# EasyEDA Pro project ProPrj_rk3568B2_2026-10-28.epro, schematic Schematic1, sheets 1 to 12 of 19

## Sheets
1 外设资源分配&上电时序: Board Name: Schematic1; Create Date: 2025-08-15; Page Name: 外设资源分配&上电时序; Project Name: ProDoc_Schematic1_2026-03-04; Schematic Name: Schematic1; Update Date: 2025-09-28; BladeWidth: 10; Company: 嘉立创EDA; Page Size: A4; RegionStart: 1; ShowBorder: 1; TitleBlock: 1; TitleBlockPosition: 3; Version: V1.0; XRegionCount: 6; YRegionCount: 4
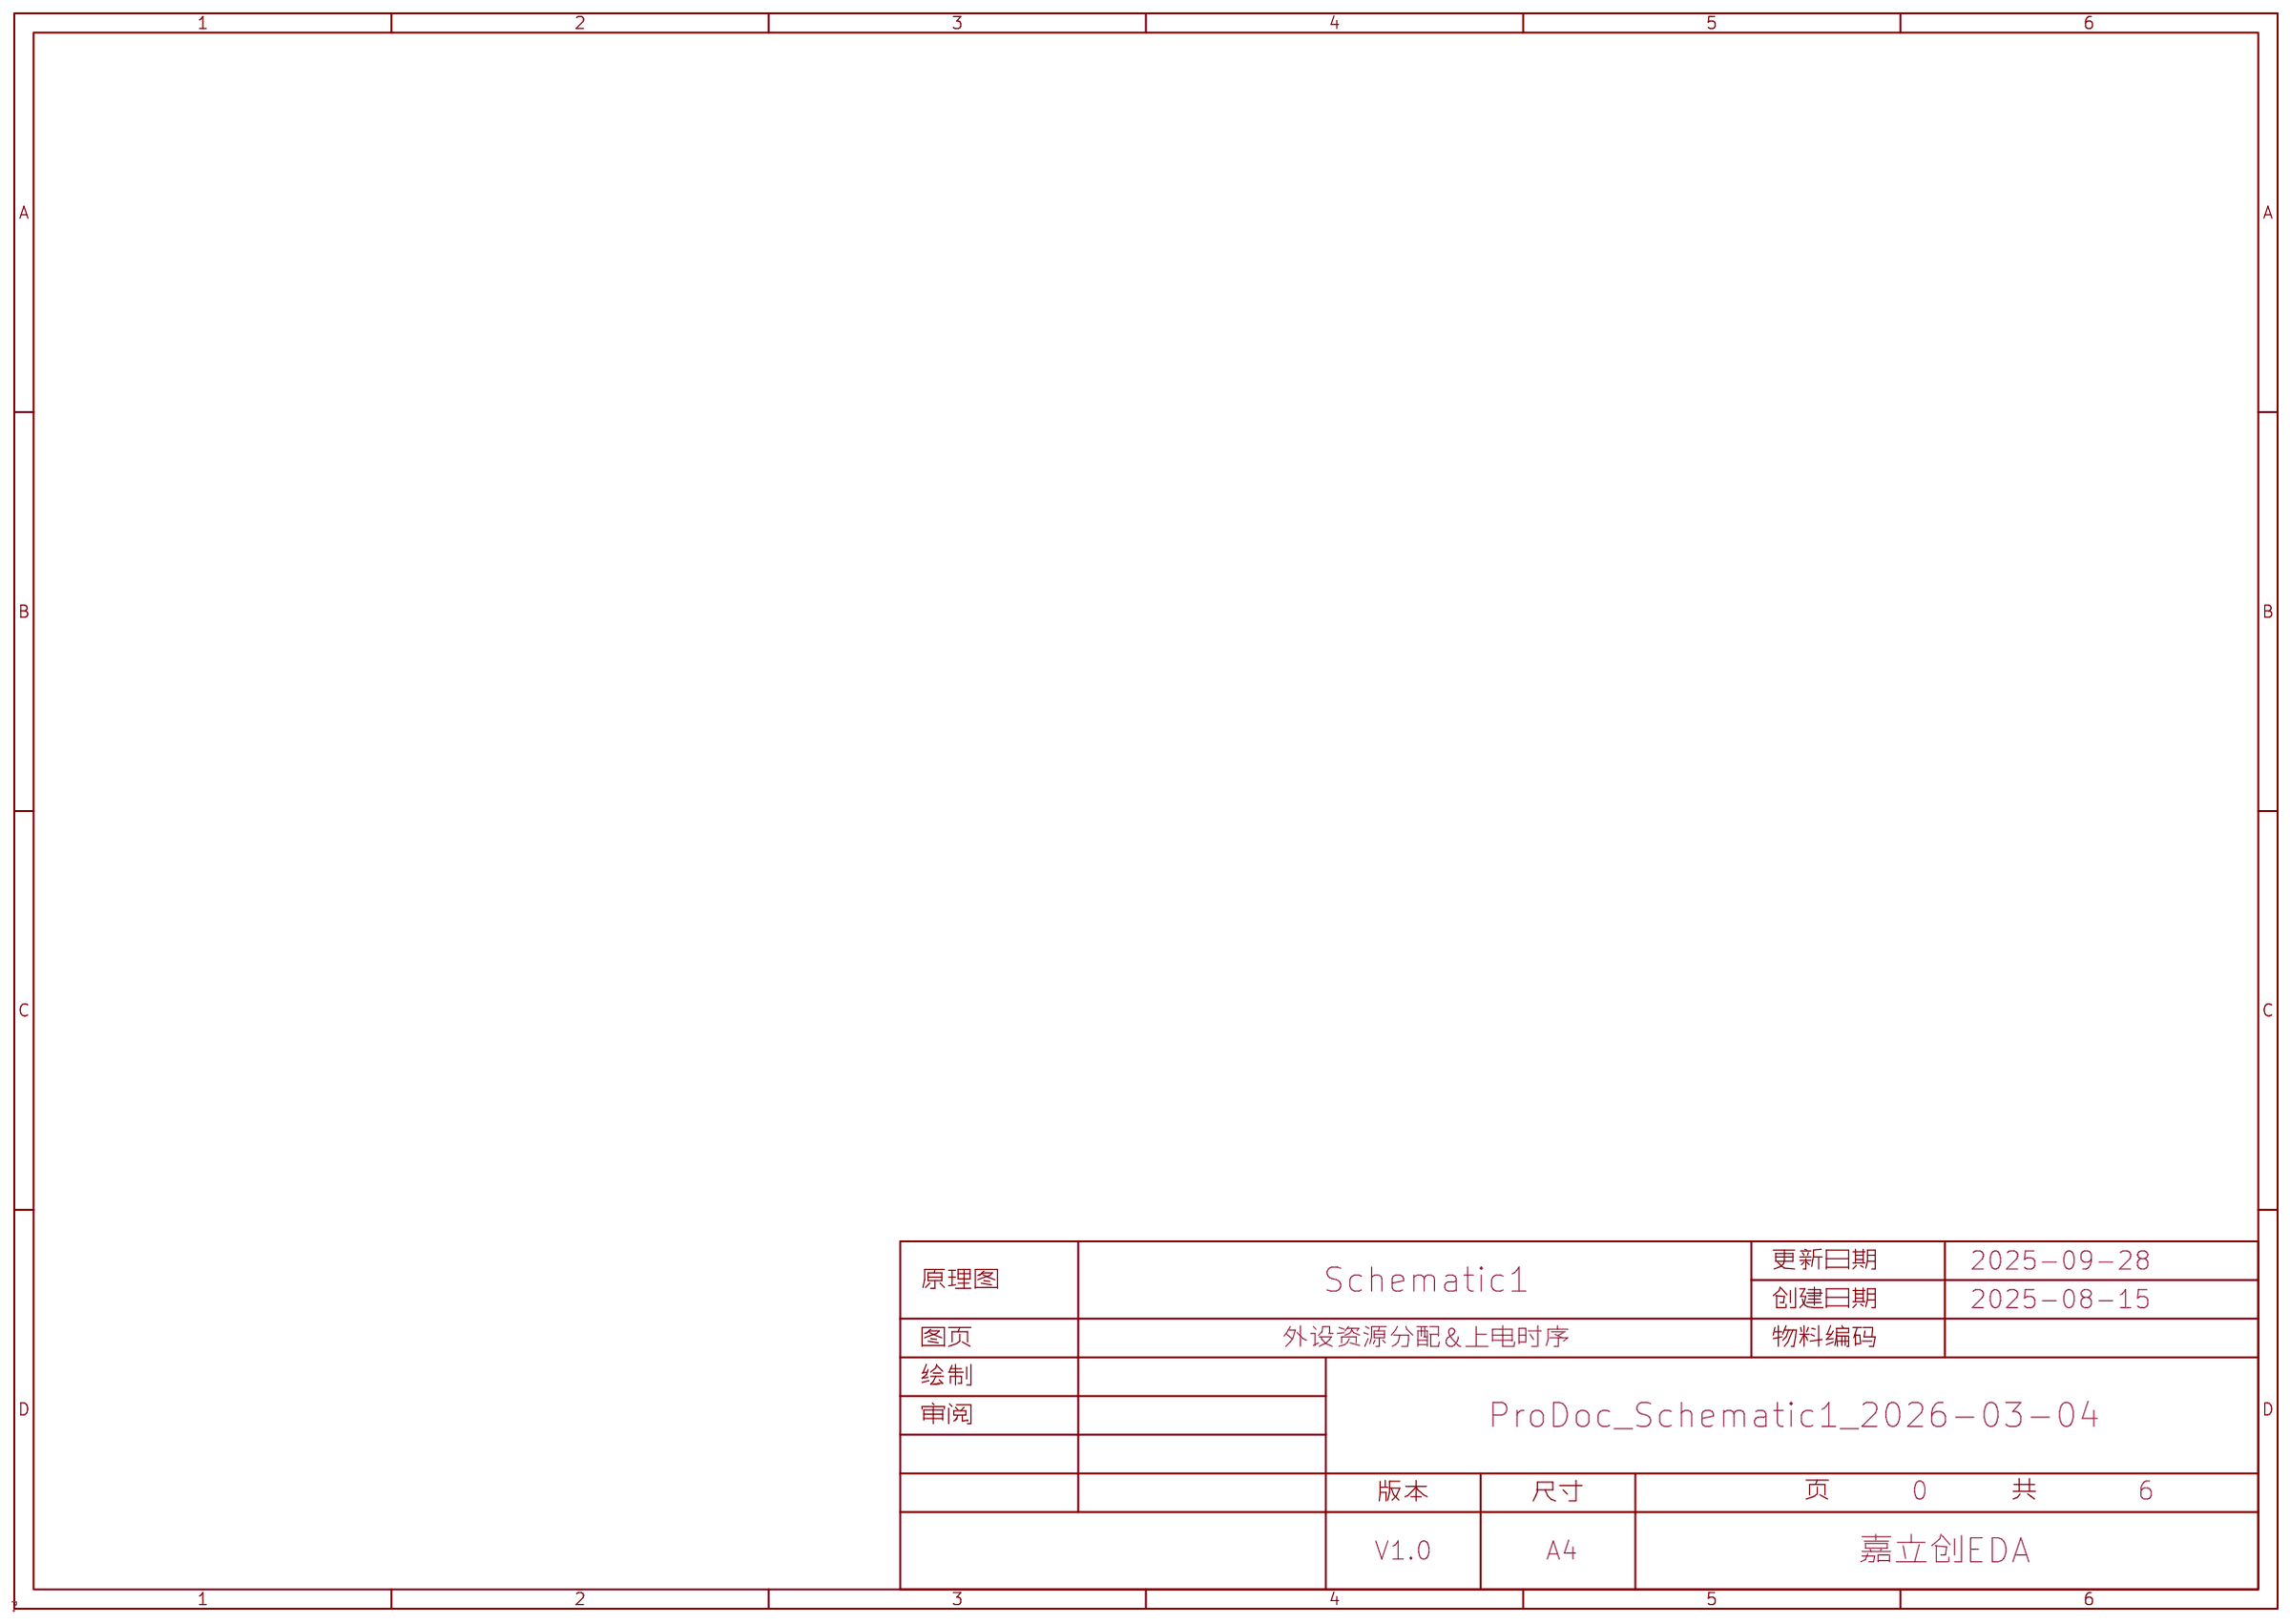
[diagram p0: 外设资源分配&上电时序]
2 EMMC: Board Name: Board1; Create Date: 2025-09-11; Page Name: EMMC; Project Name: RK3568B2地瓜派; Update Date: 2025-09-11
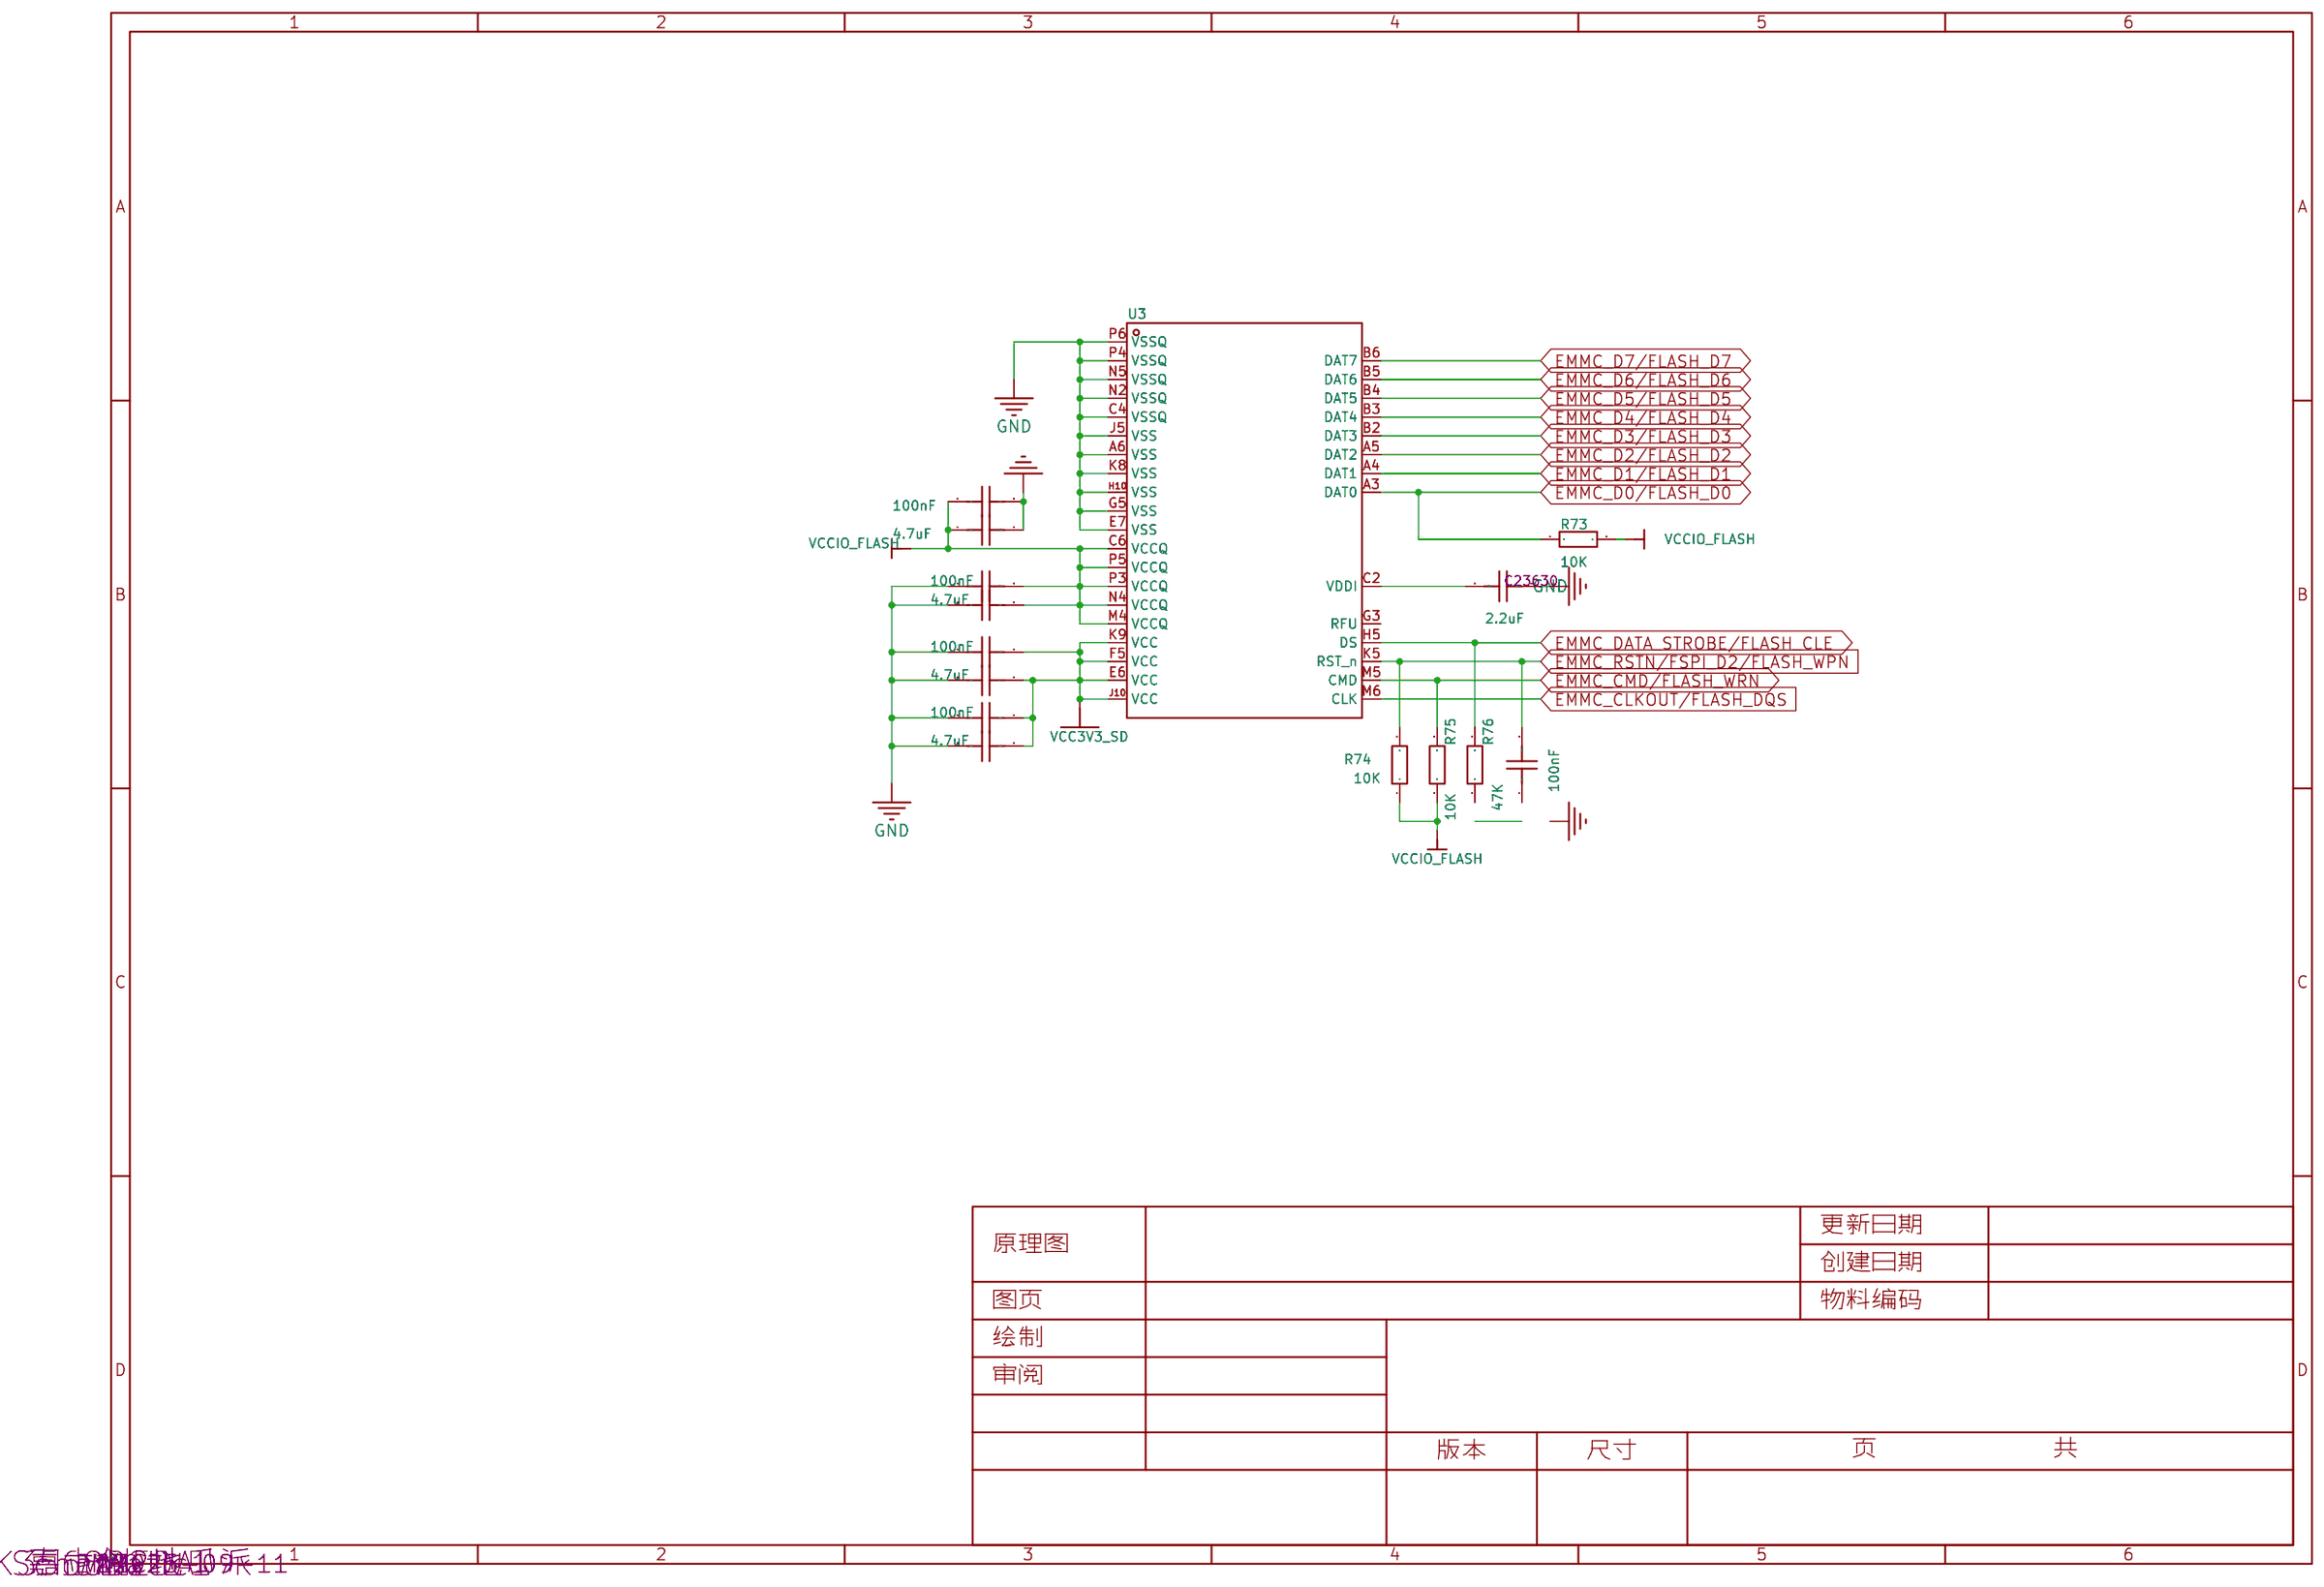
[diagram p1: EMMC]
3 SOC_DISPLAY: Board Name: Board1; Page Name: SOC_DISPLAY; Project Name: RK3568_LPD4X_120P_Core; Update Date: 2025-08-25
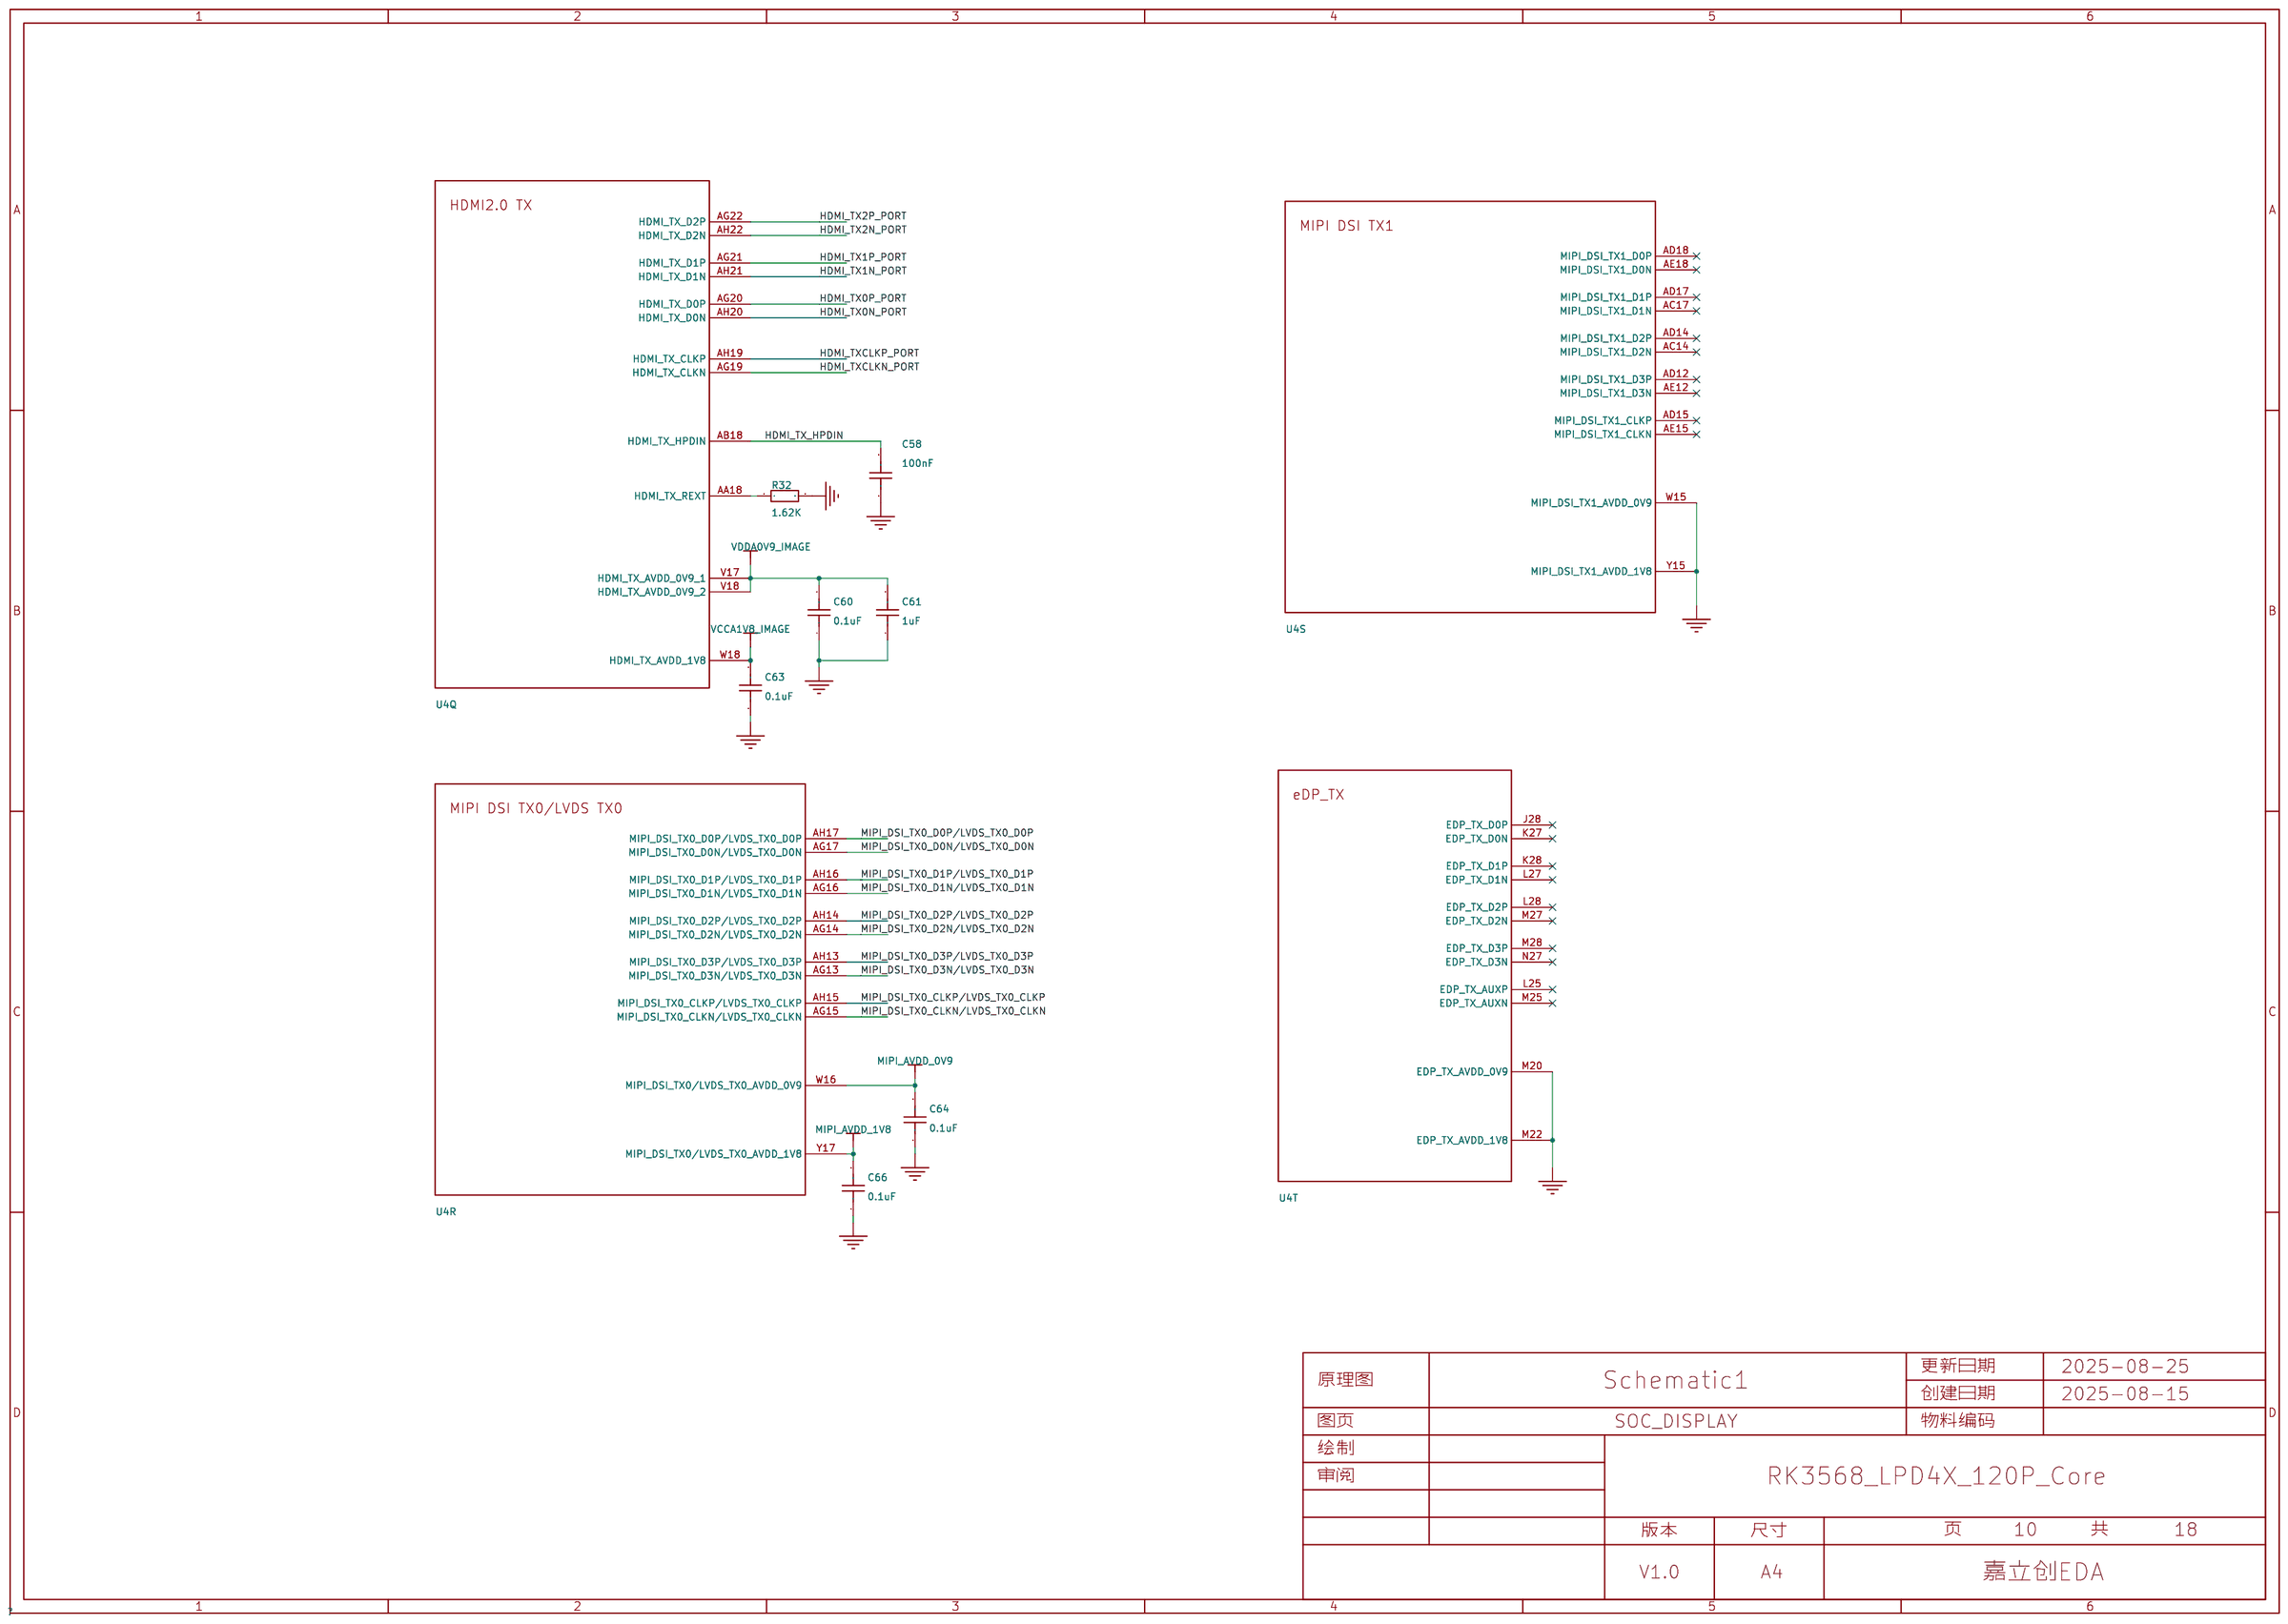
[diagram p2: SOC_DISPLAY]
4 SOC_CAM: Board Name: Board1; Page Name: SOC_CAM; Project Name: RK3568_LPD4X_120P_Core; Update Date: 2025-08-22
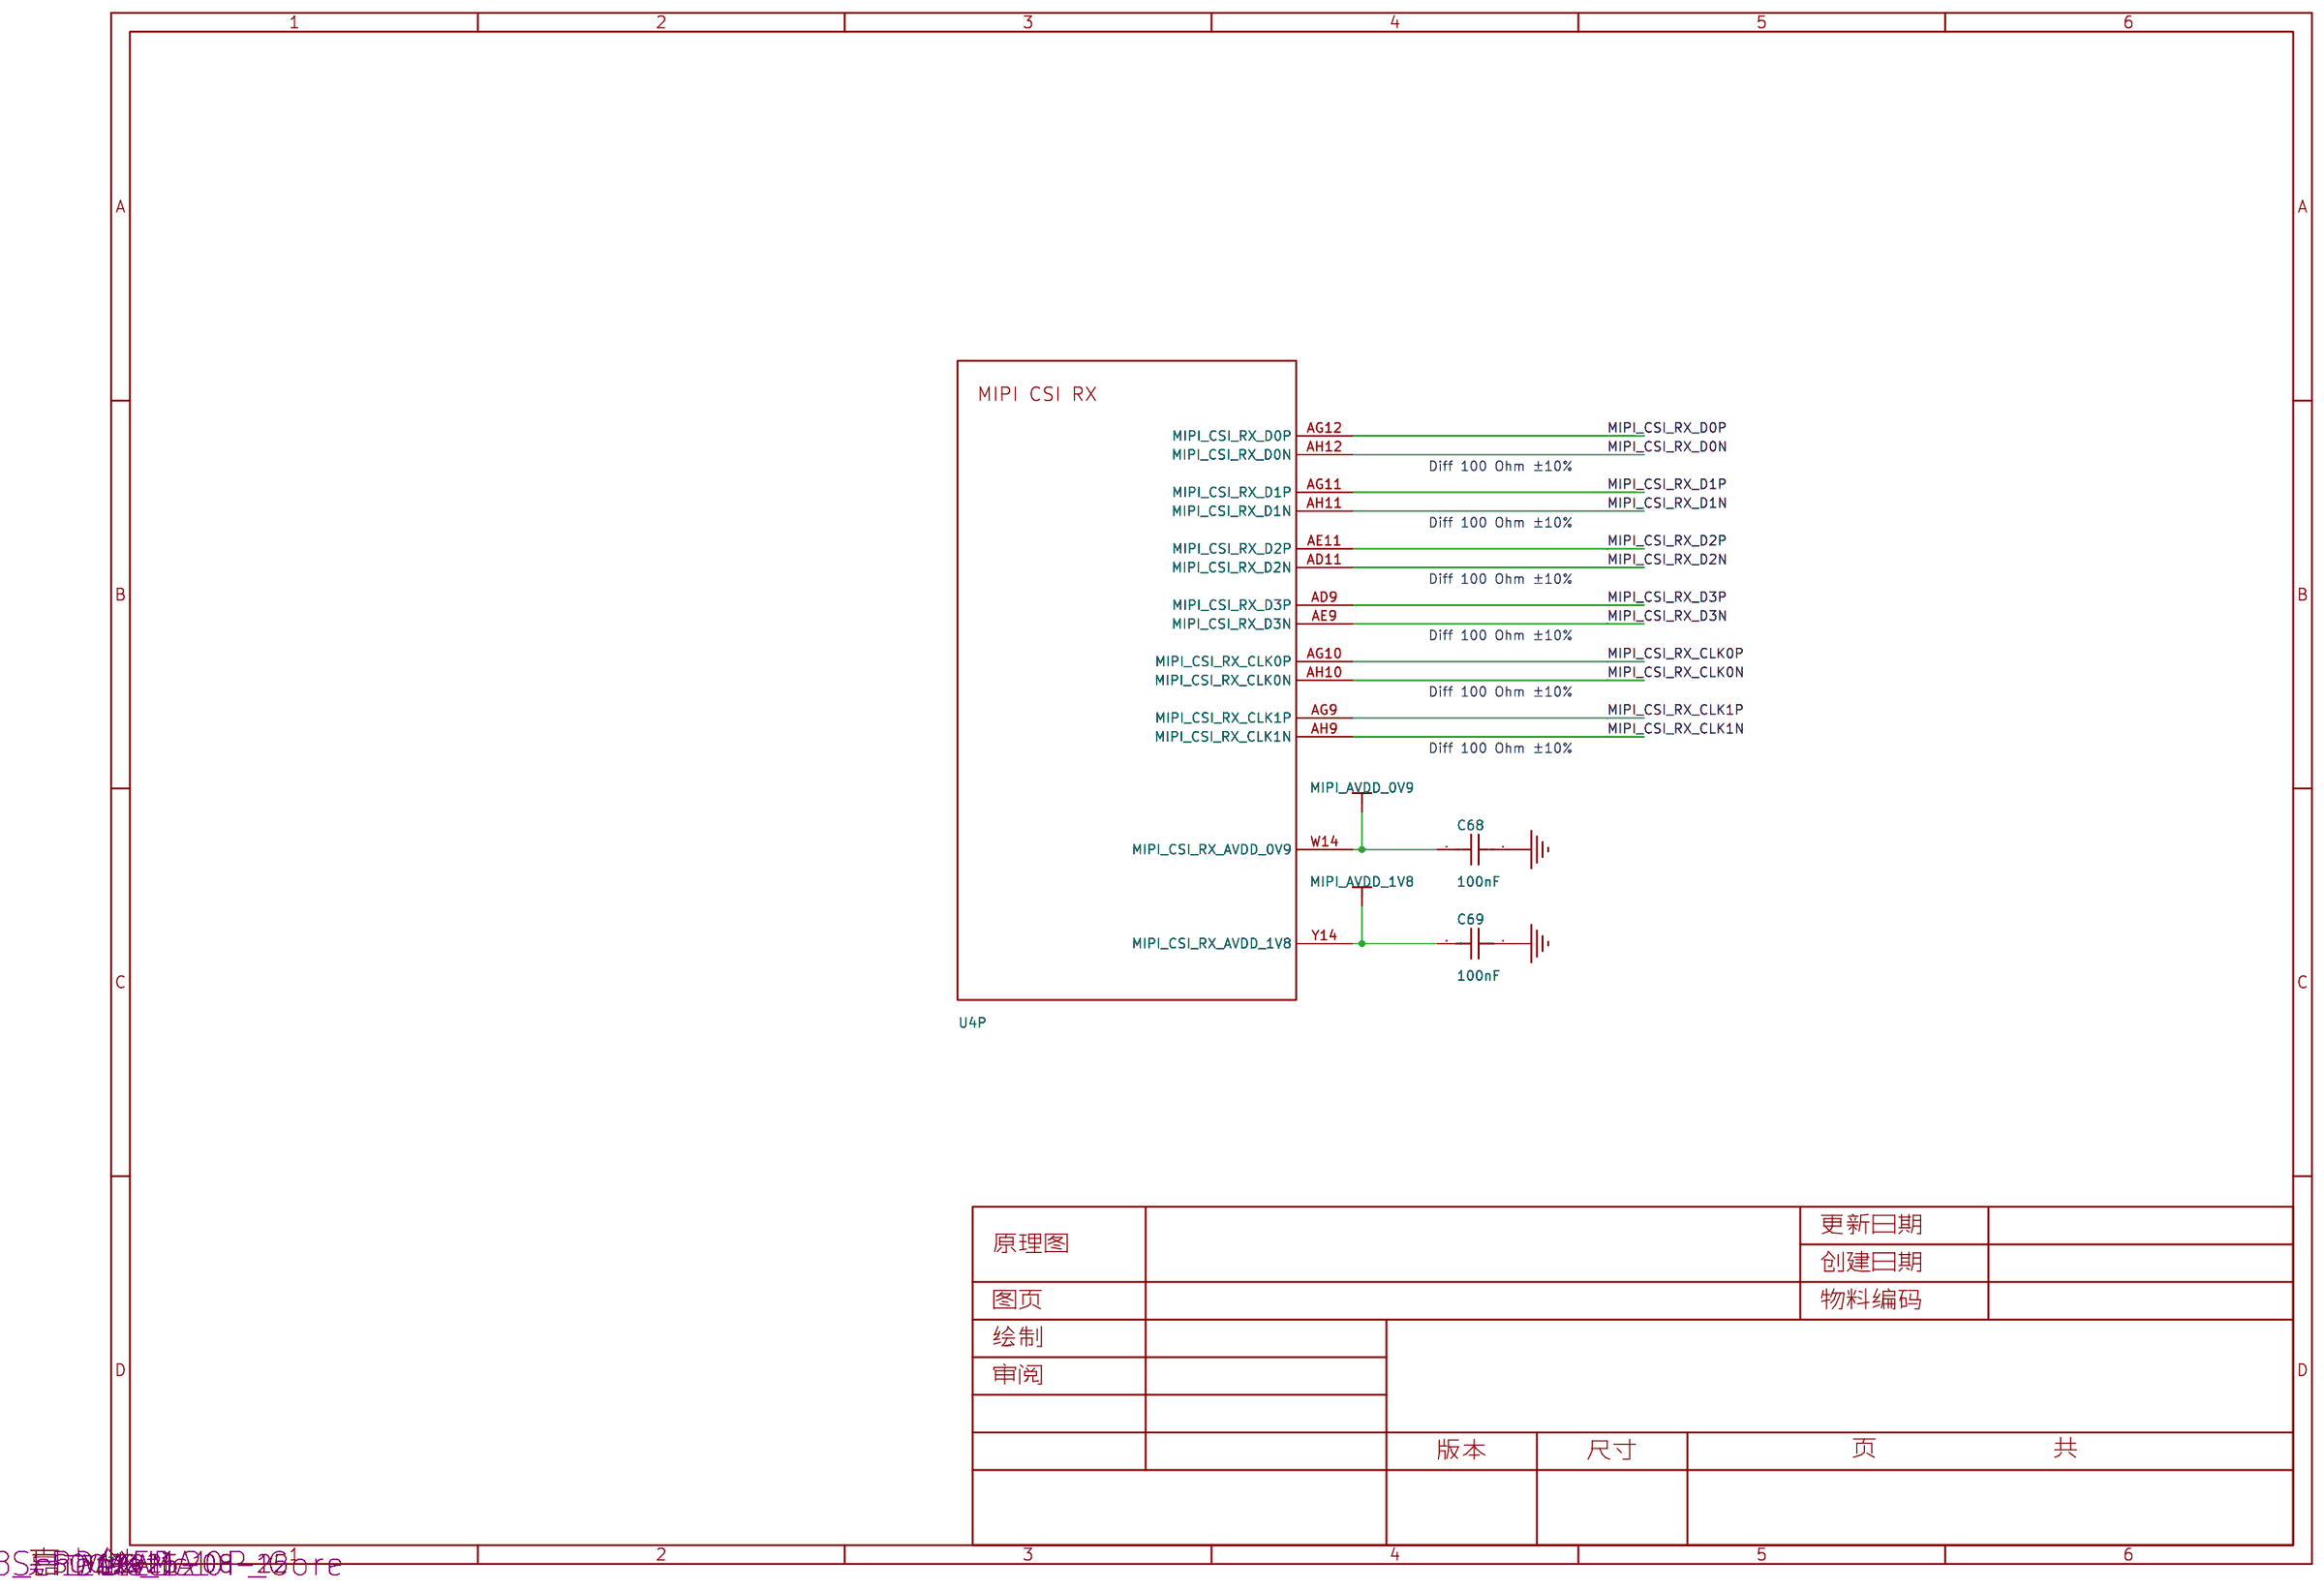
[diagram p3: SOC_CAM]
5 SOC_SOUND: Board Name: Board1; Create Date: 2025-09-11; Page Name: SOC_SOUND; Project Name: RK3568B2地瓜派; Update Date: 2025-09-11
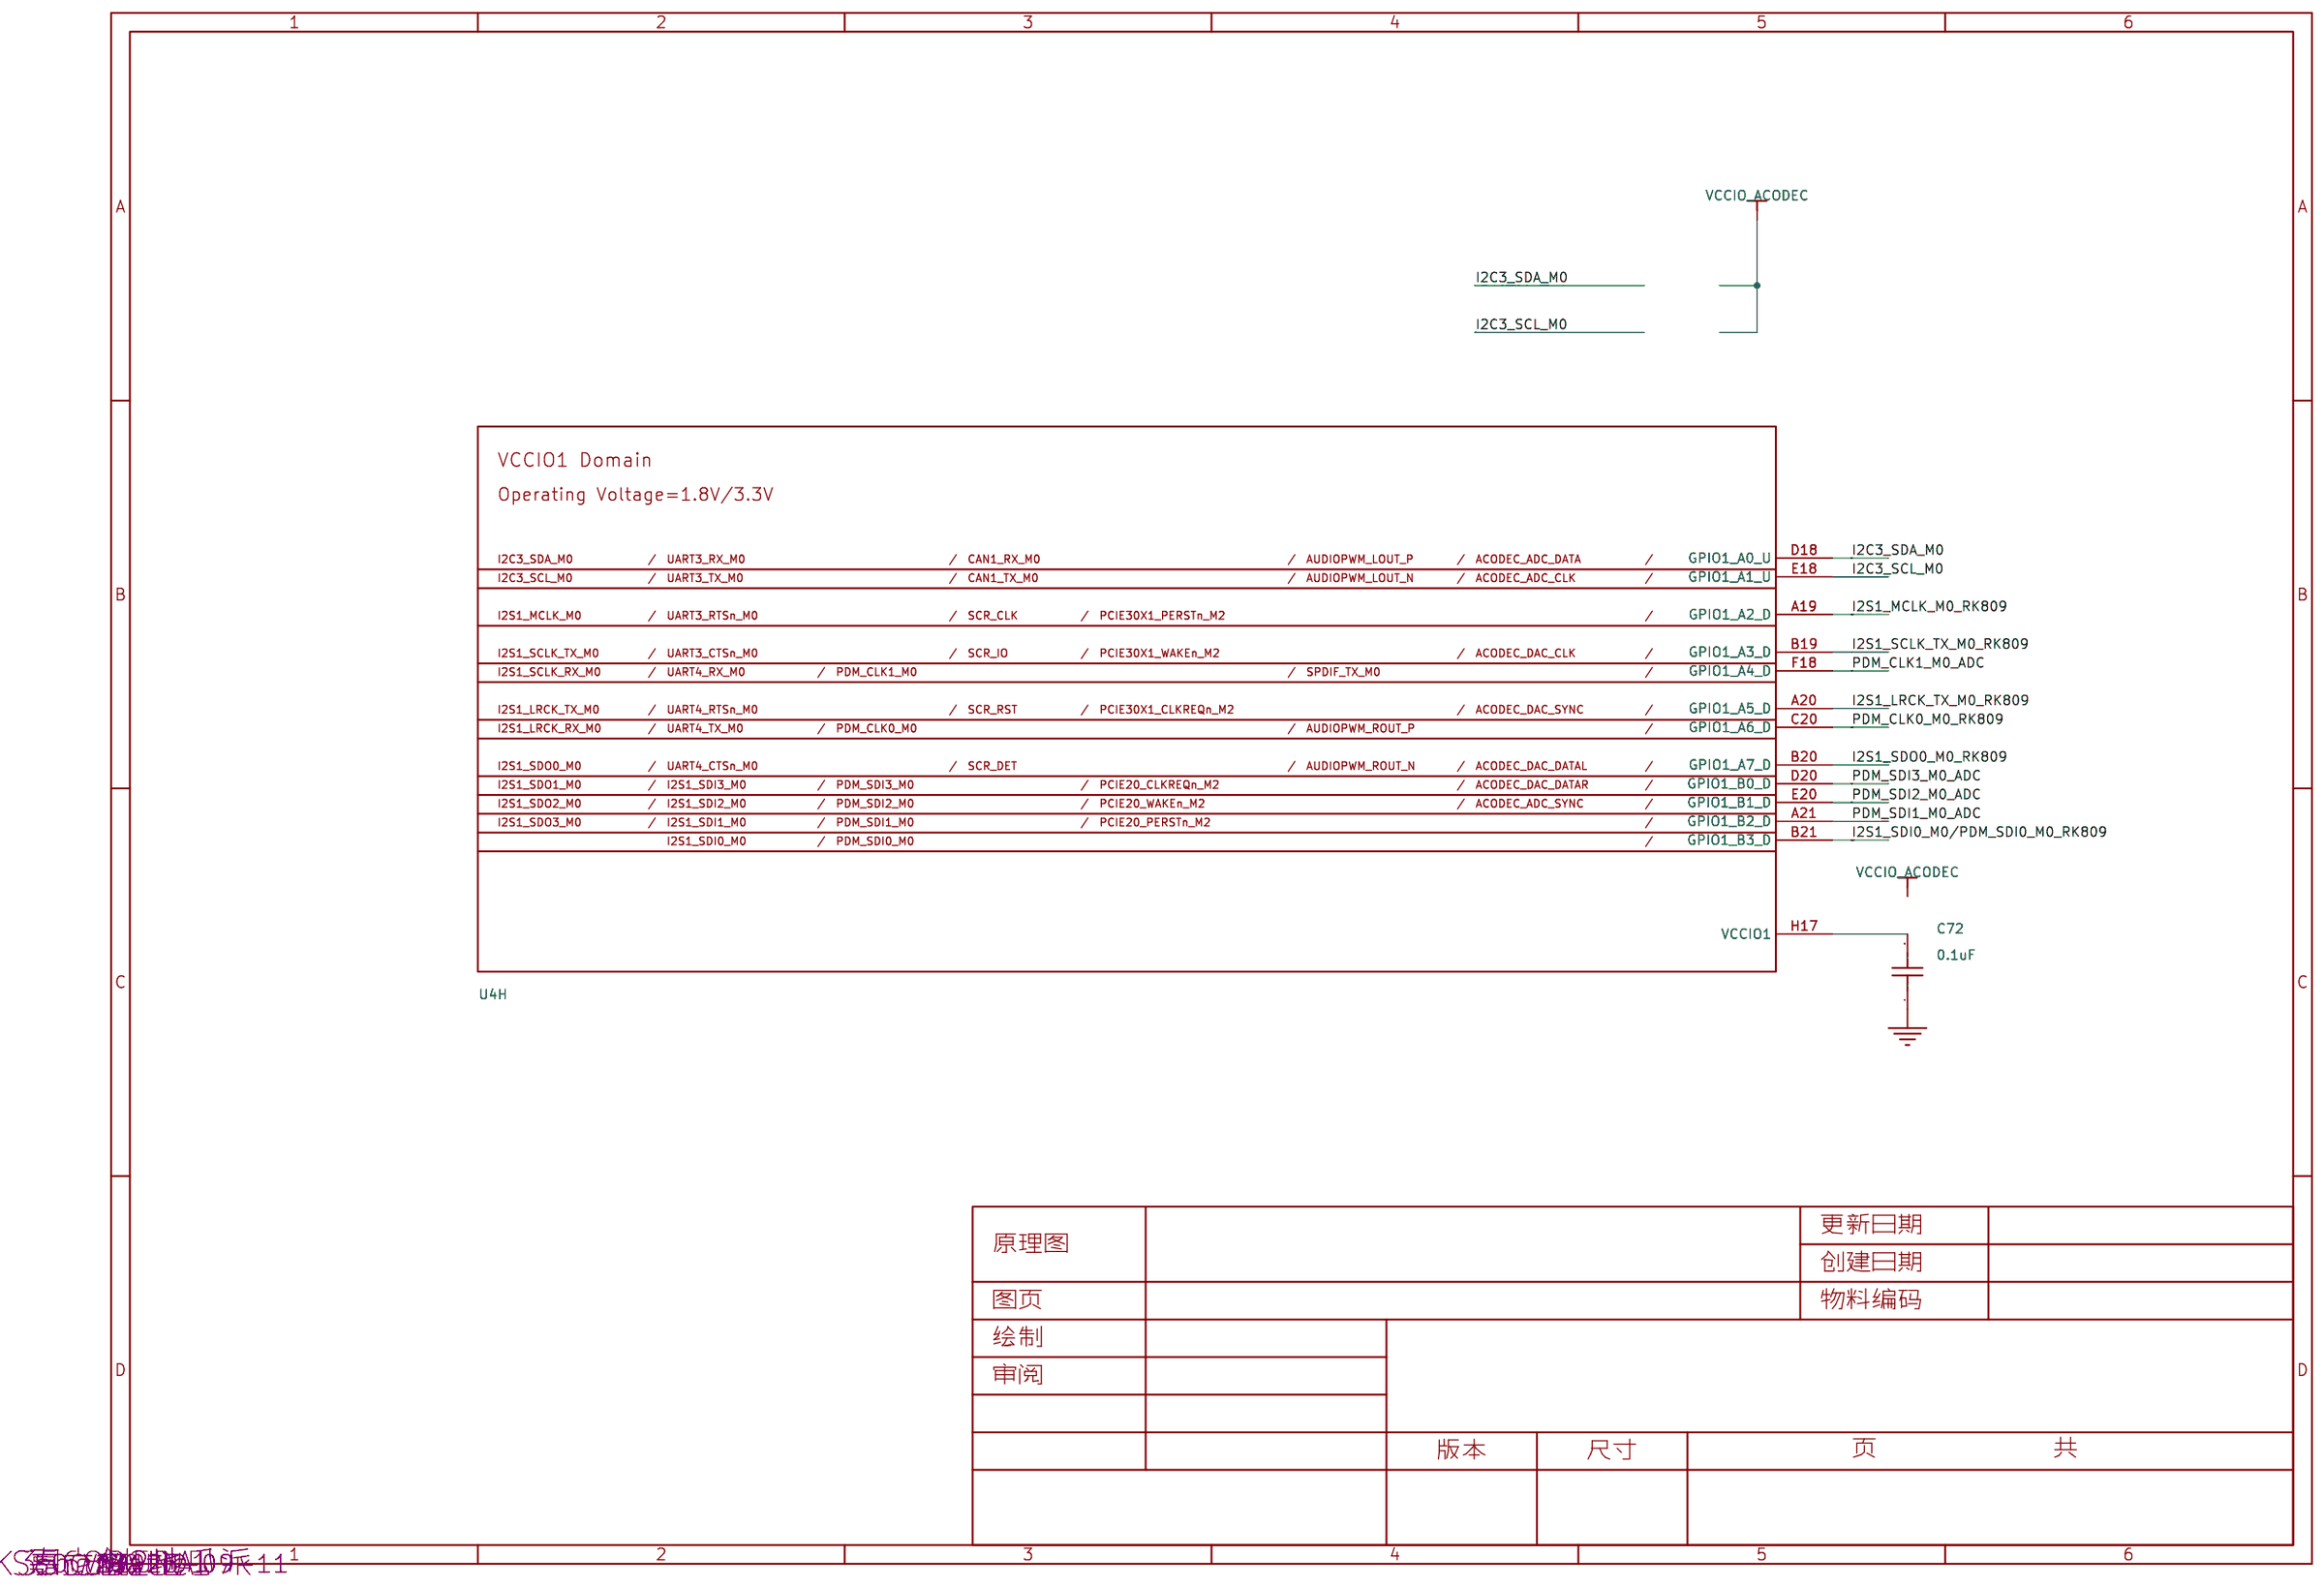
[diagram p4: SOC_SOUND]
6 SOC_MAC/SAR/I2S: Create Date: 2026-03-04; Page Name: SOC_MAC/SAR/I2S; Project Name: rk3568B2; Update Date: 2026-03-05
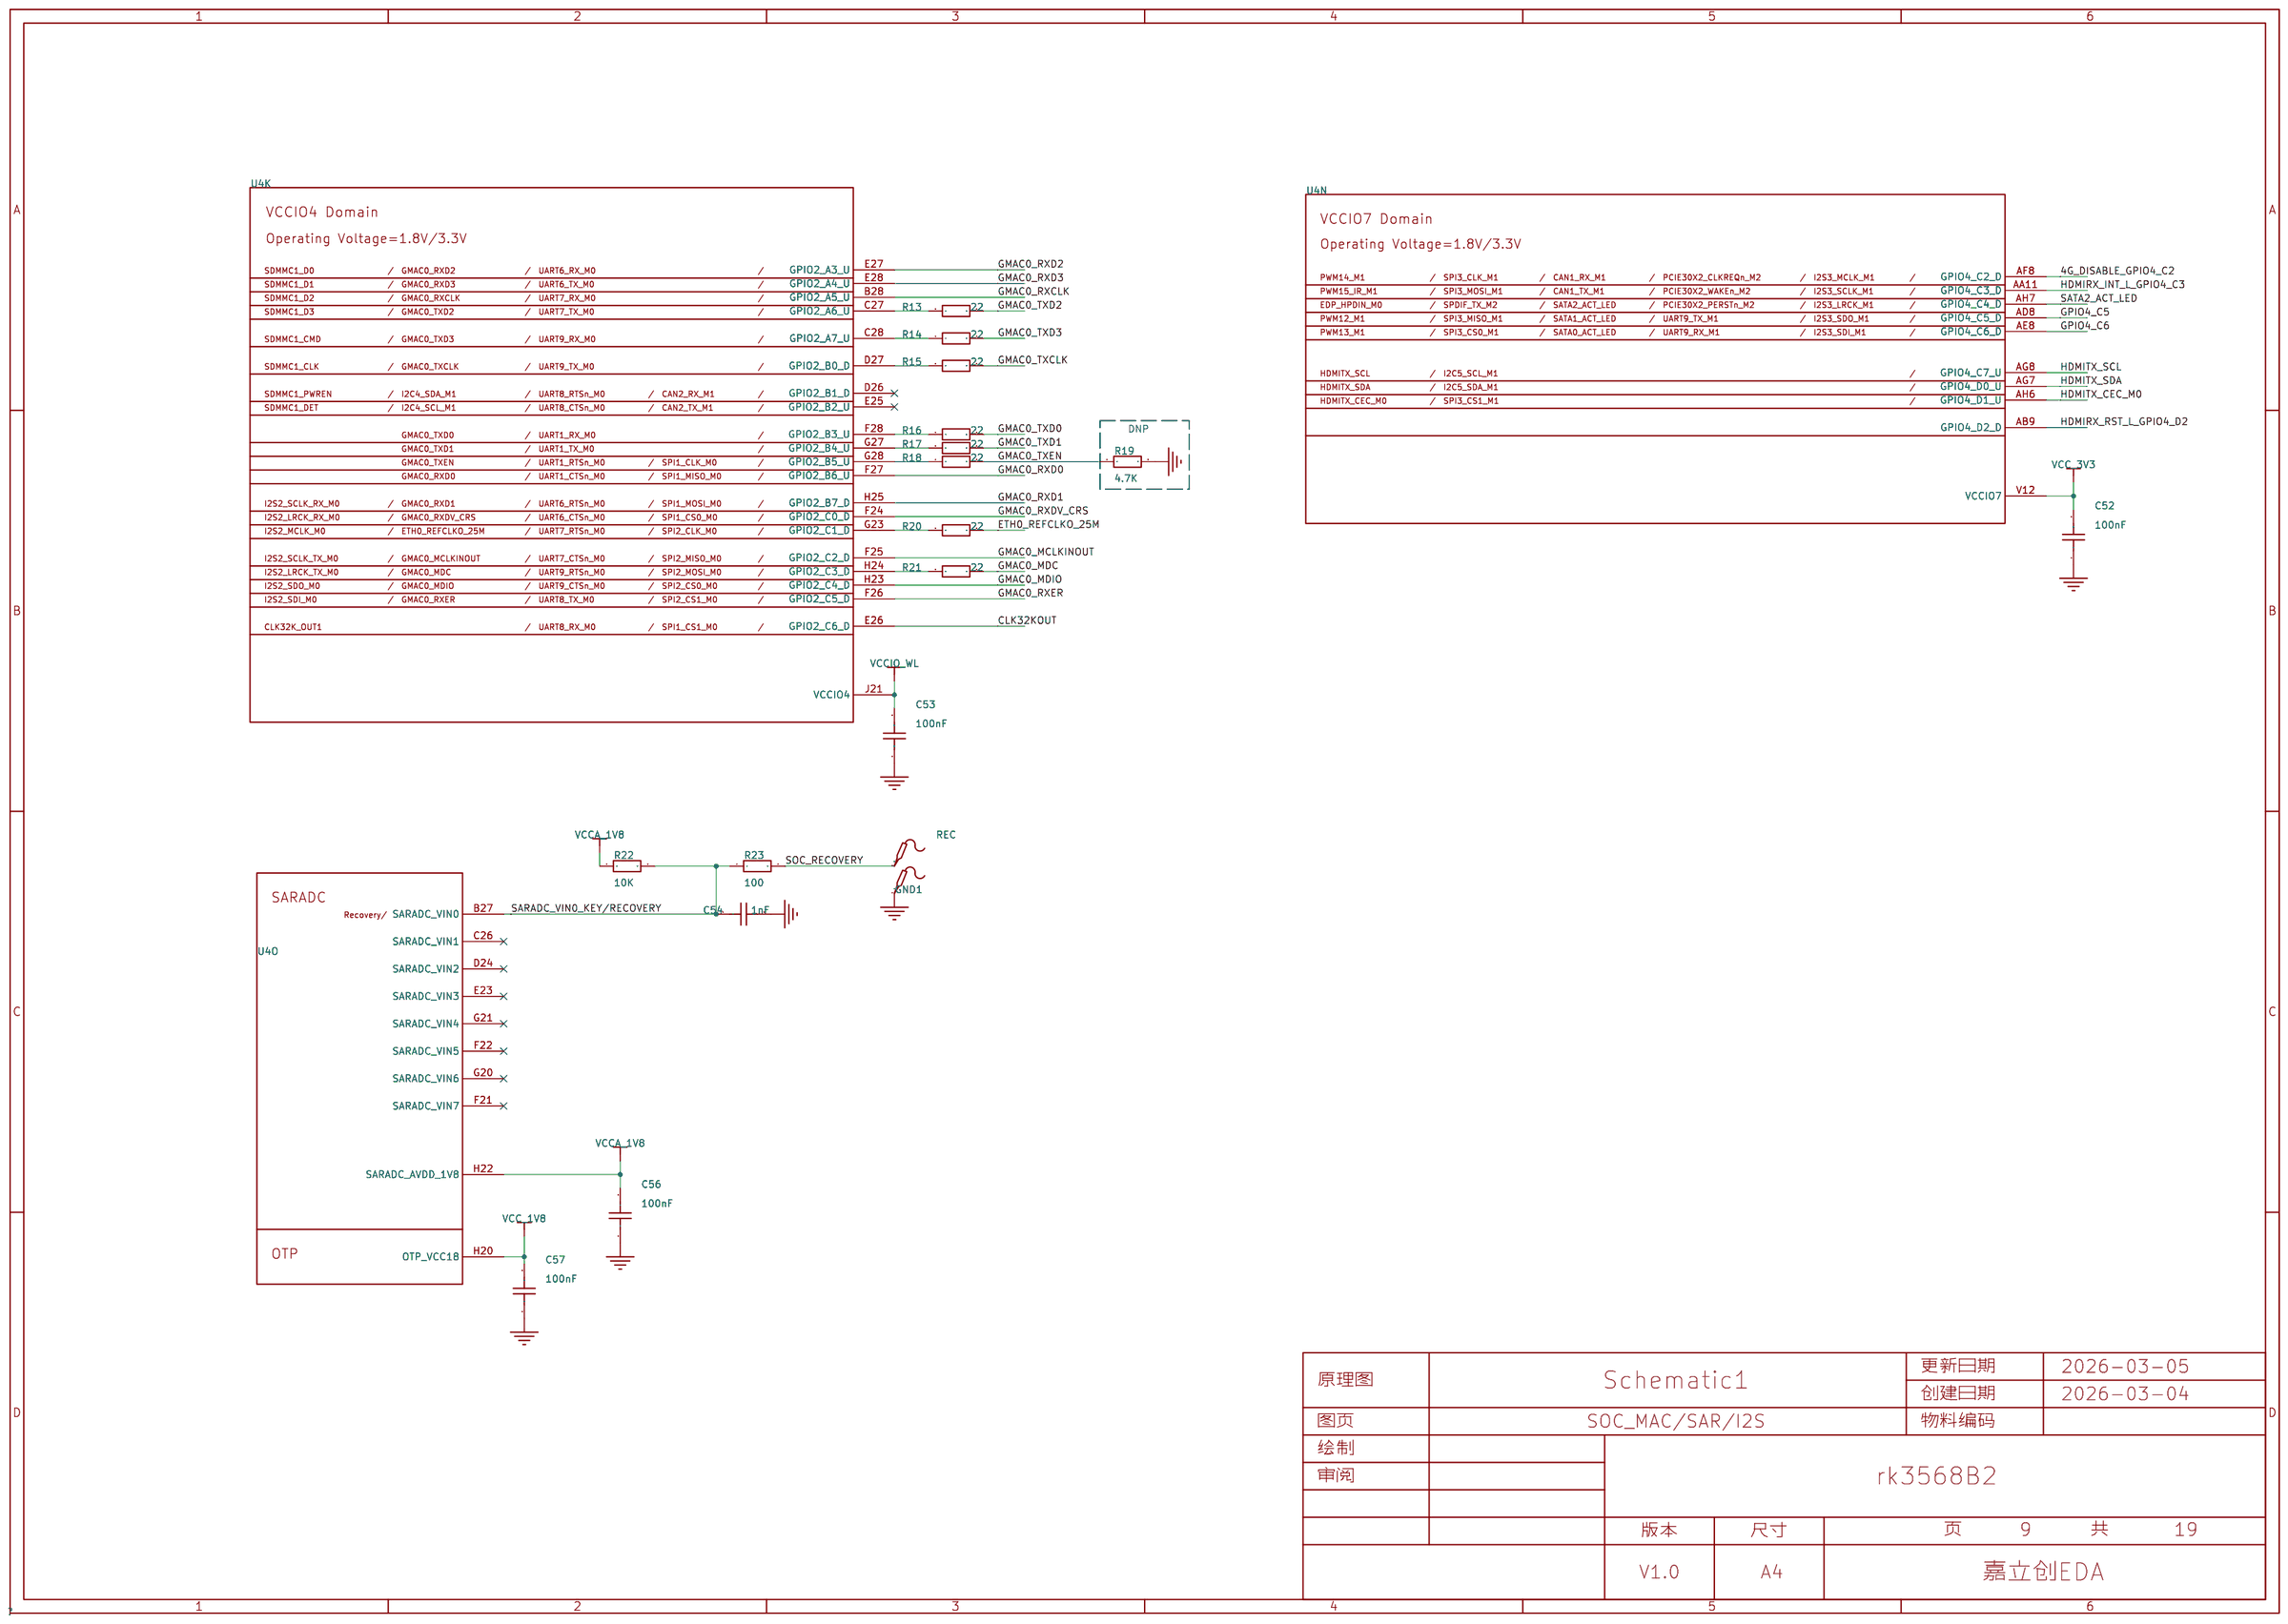
[diagram p5: SOC_MAC/SAR/I2S]
7 SOC_DDR: Board Name: Board1; Create Date: 2025-09-11; Page Name: SOC_DDR; Project Name: RK3568B2地瓜派; Update Date: 2025-09-11
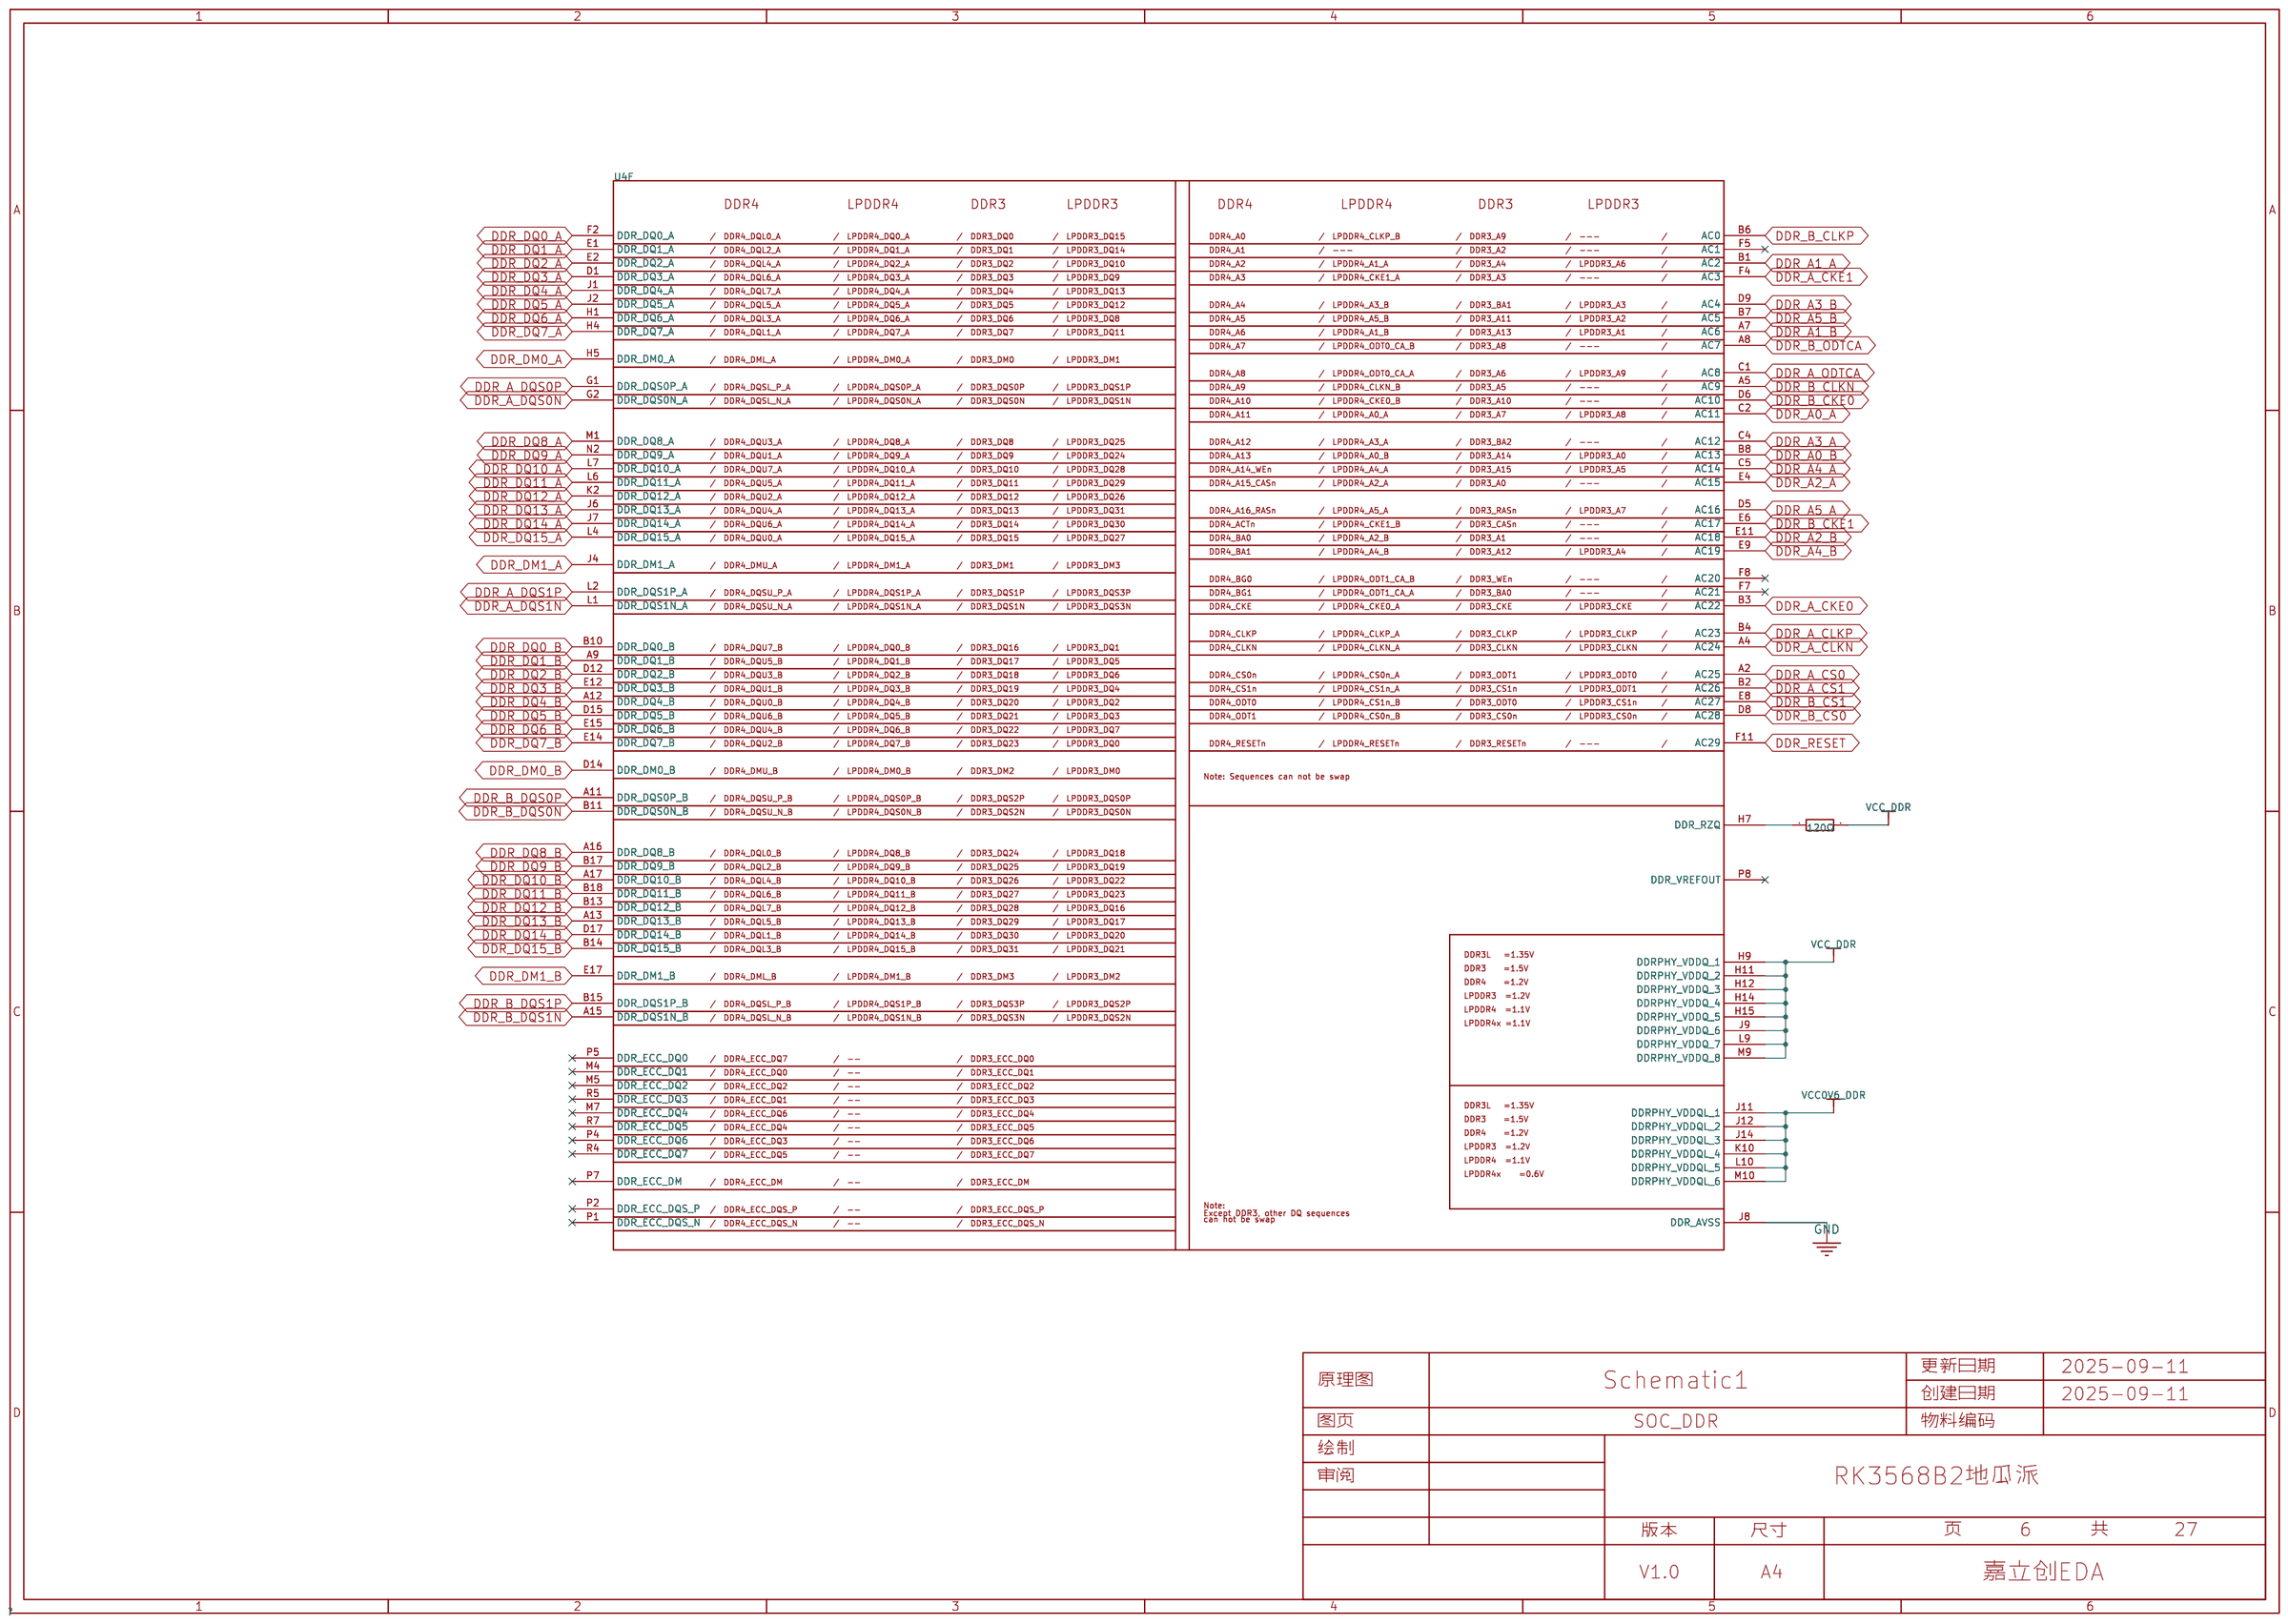
[diagram p6: SOC_DDR]
8 SOC_LOGIC: Board Name: Board1; Page Name: SOC_LOGIC; Project Name: RK3568_LPD4X_120P_Core; Update Date: 2025-08-26
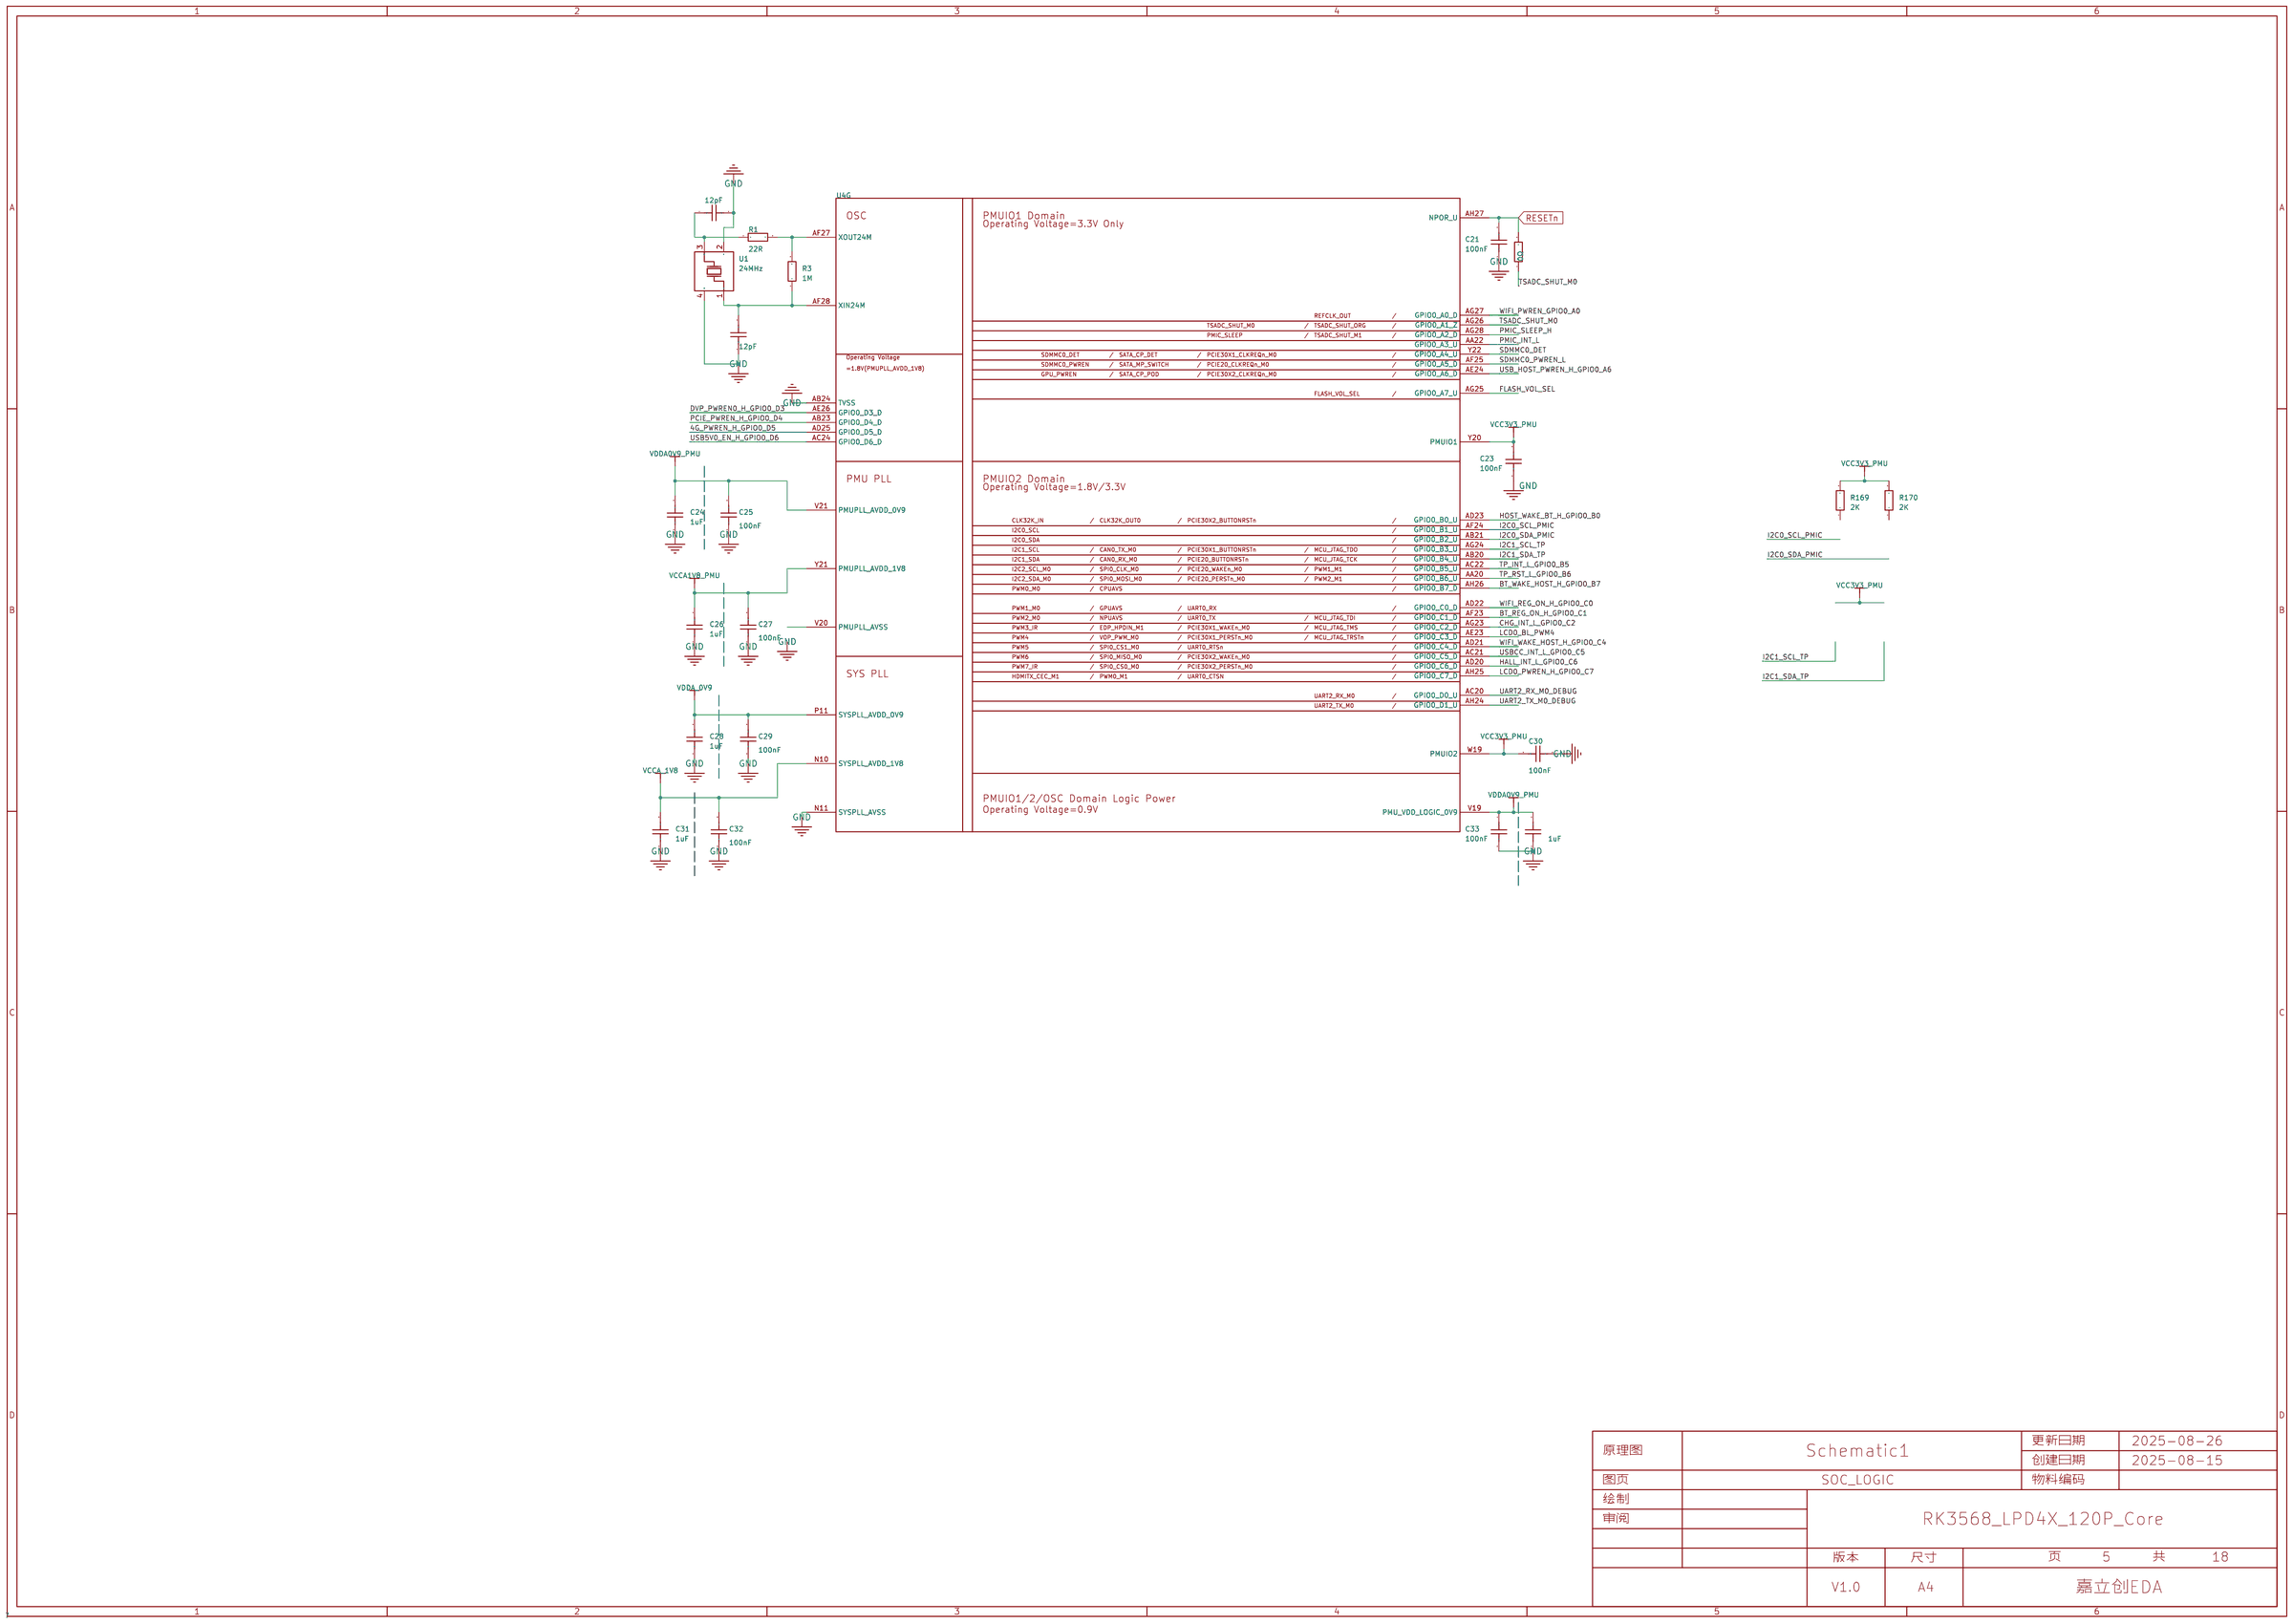
[diagram p7: SOC_LOGIC]
9 SOC_COMPHY/USB: Board Name: Board1; Page Name: SOC_COMPHY/USB; Project Name: RK3568_LPD4X_120P_Core; Update Date: 2025-08-22
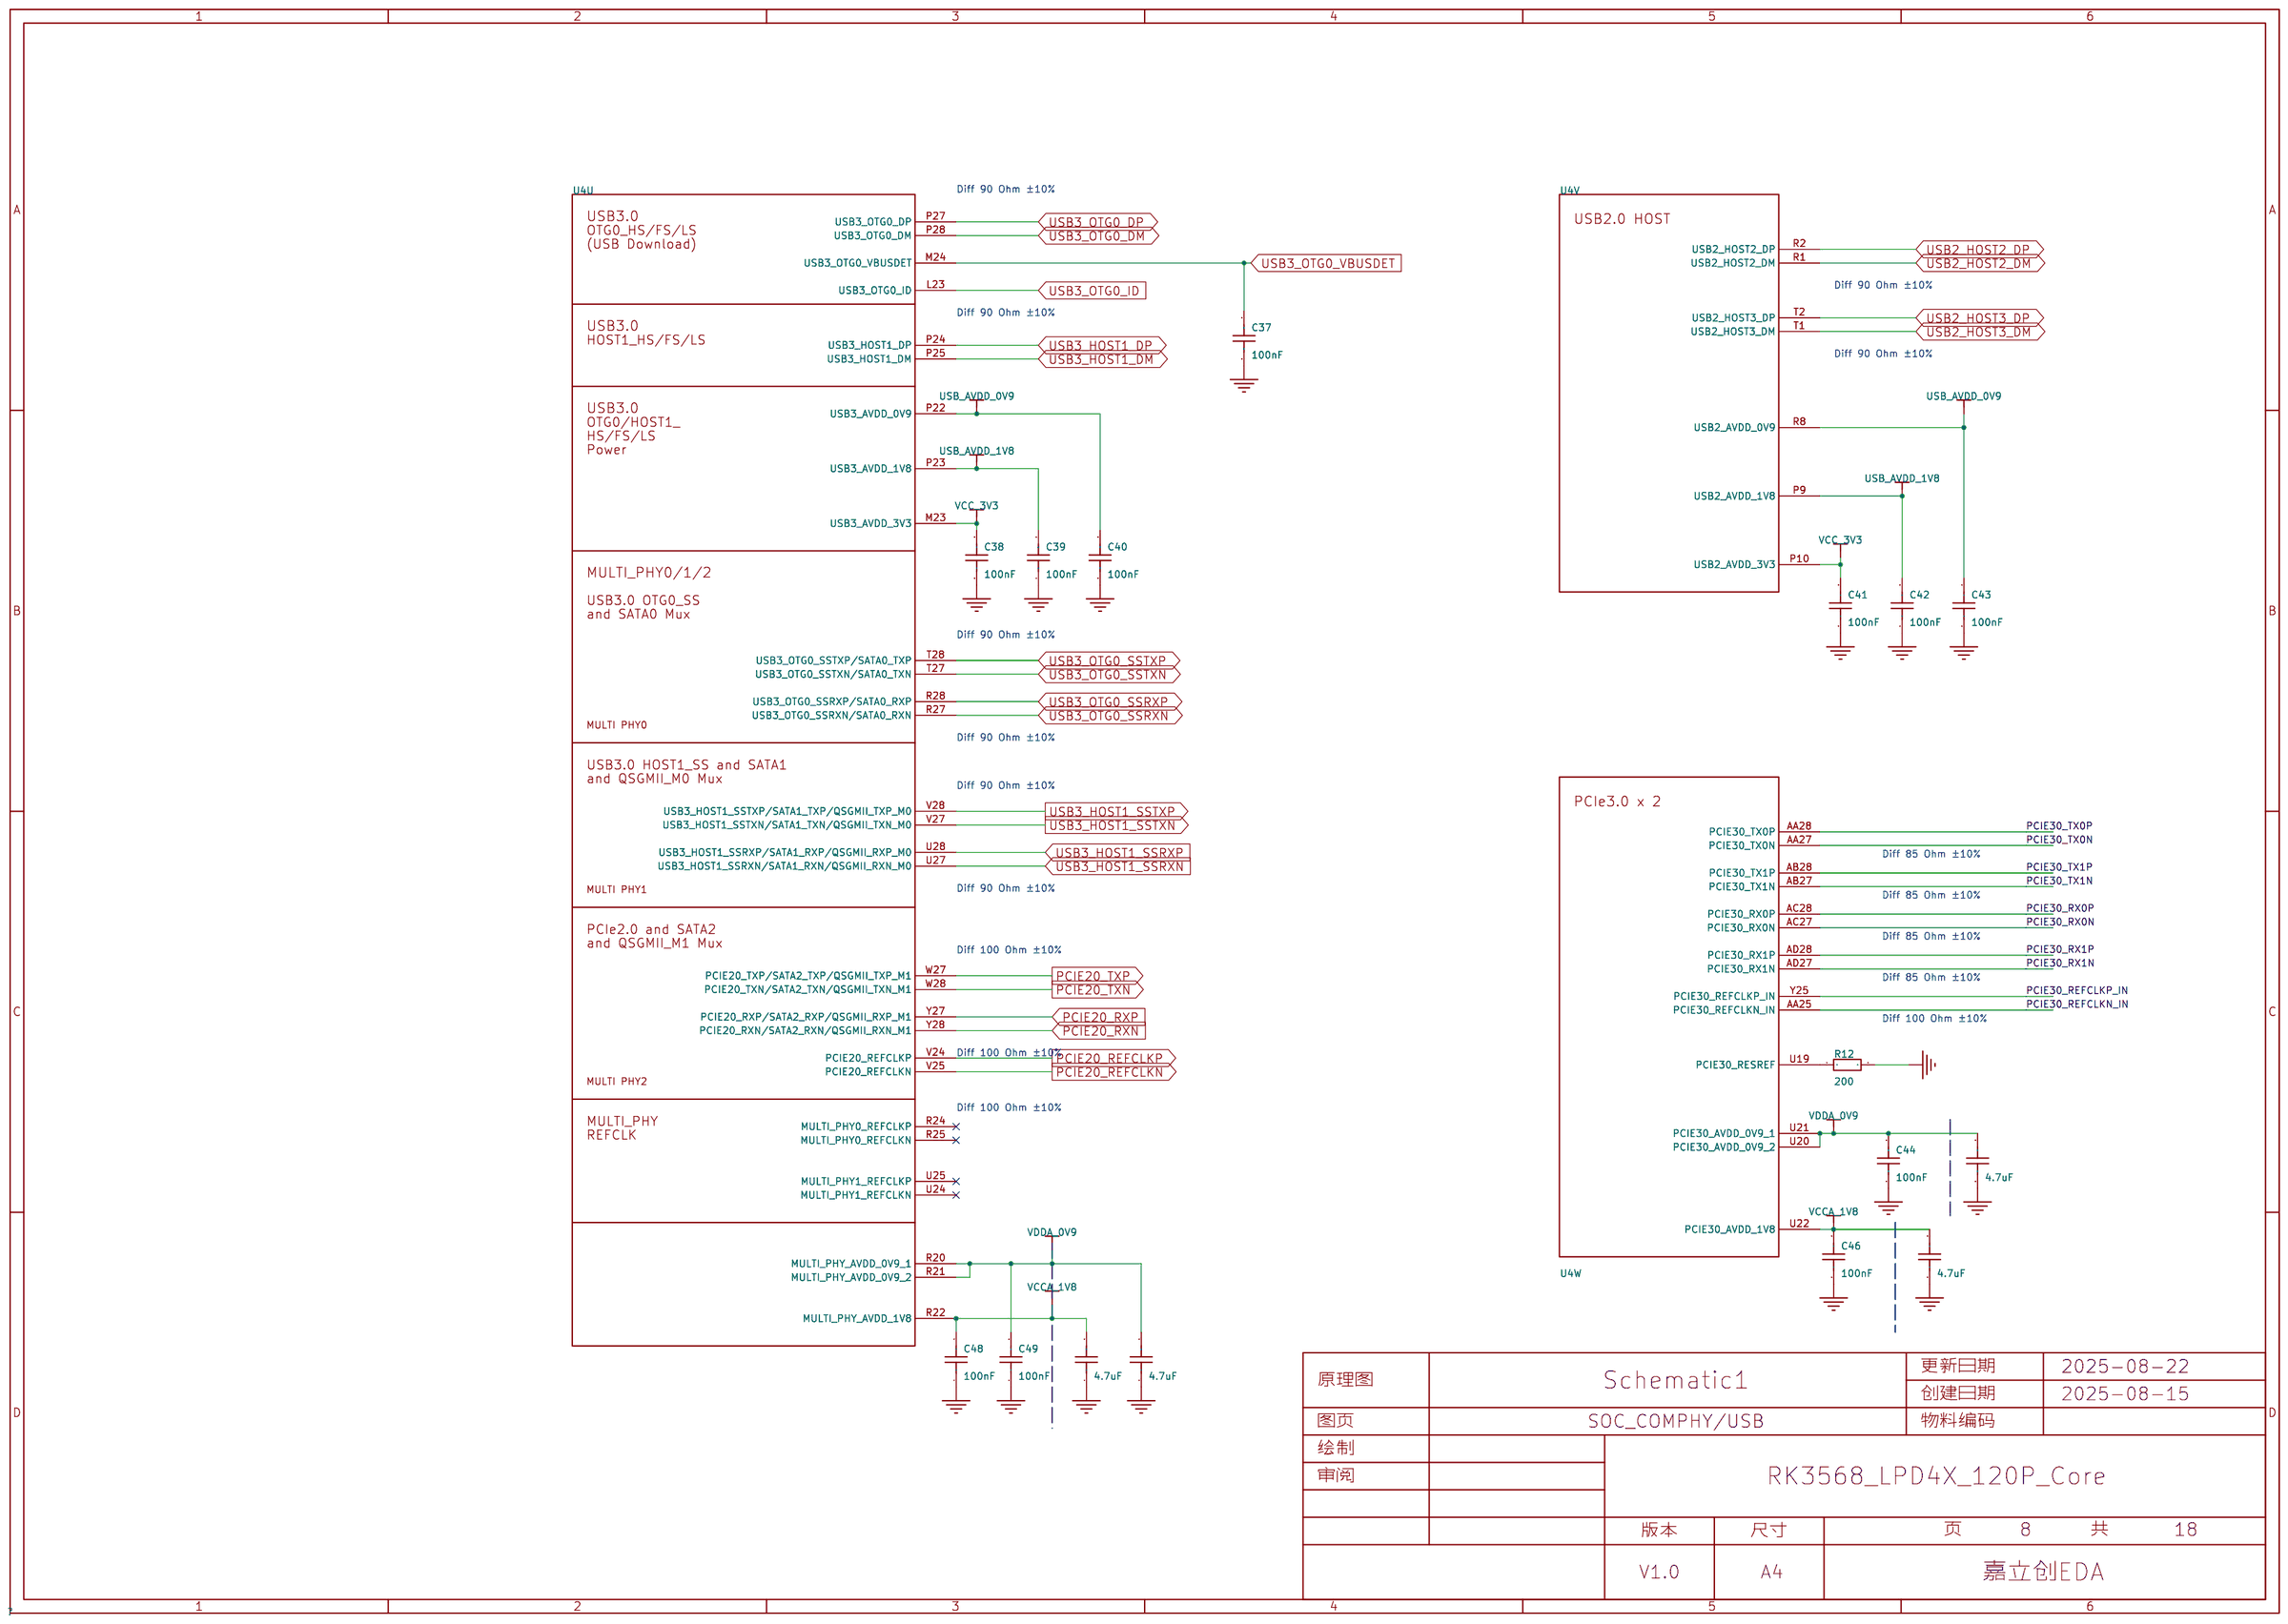
[diagram p8: SOC_COMPHY/USB]
10 SOC_PWR: Board Name: Board1; Page Name: SOC_PWR; Project Name: RK3568_LPD4X_120P_Core; Update Date: 2025-08-22
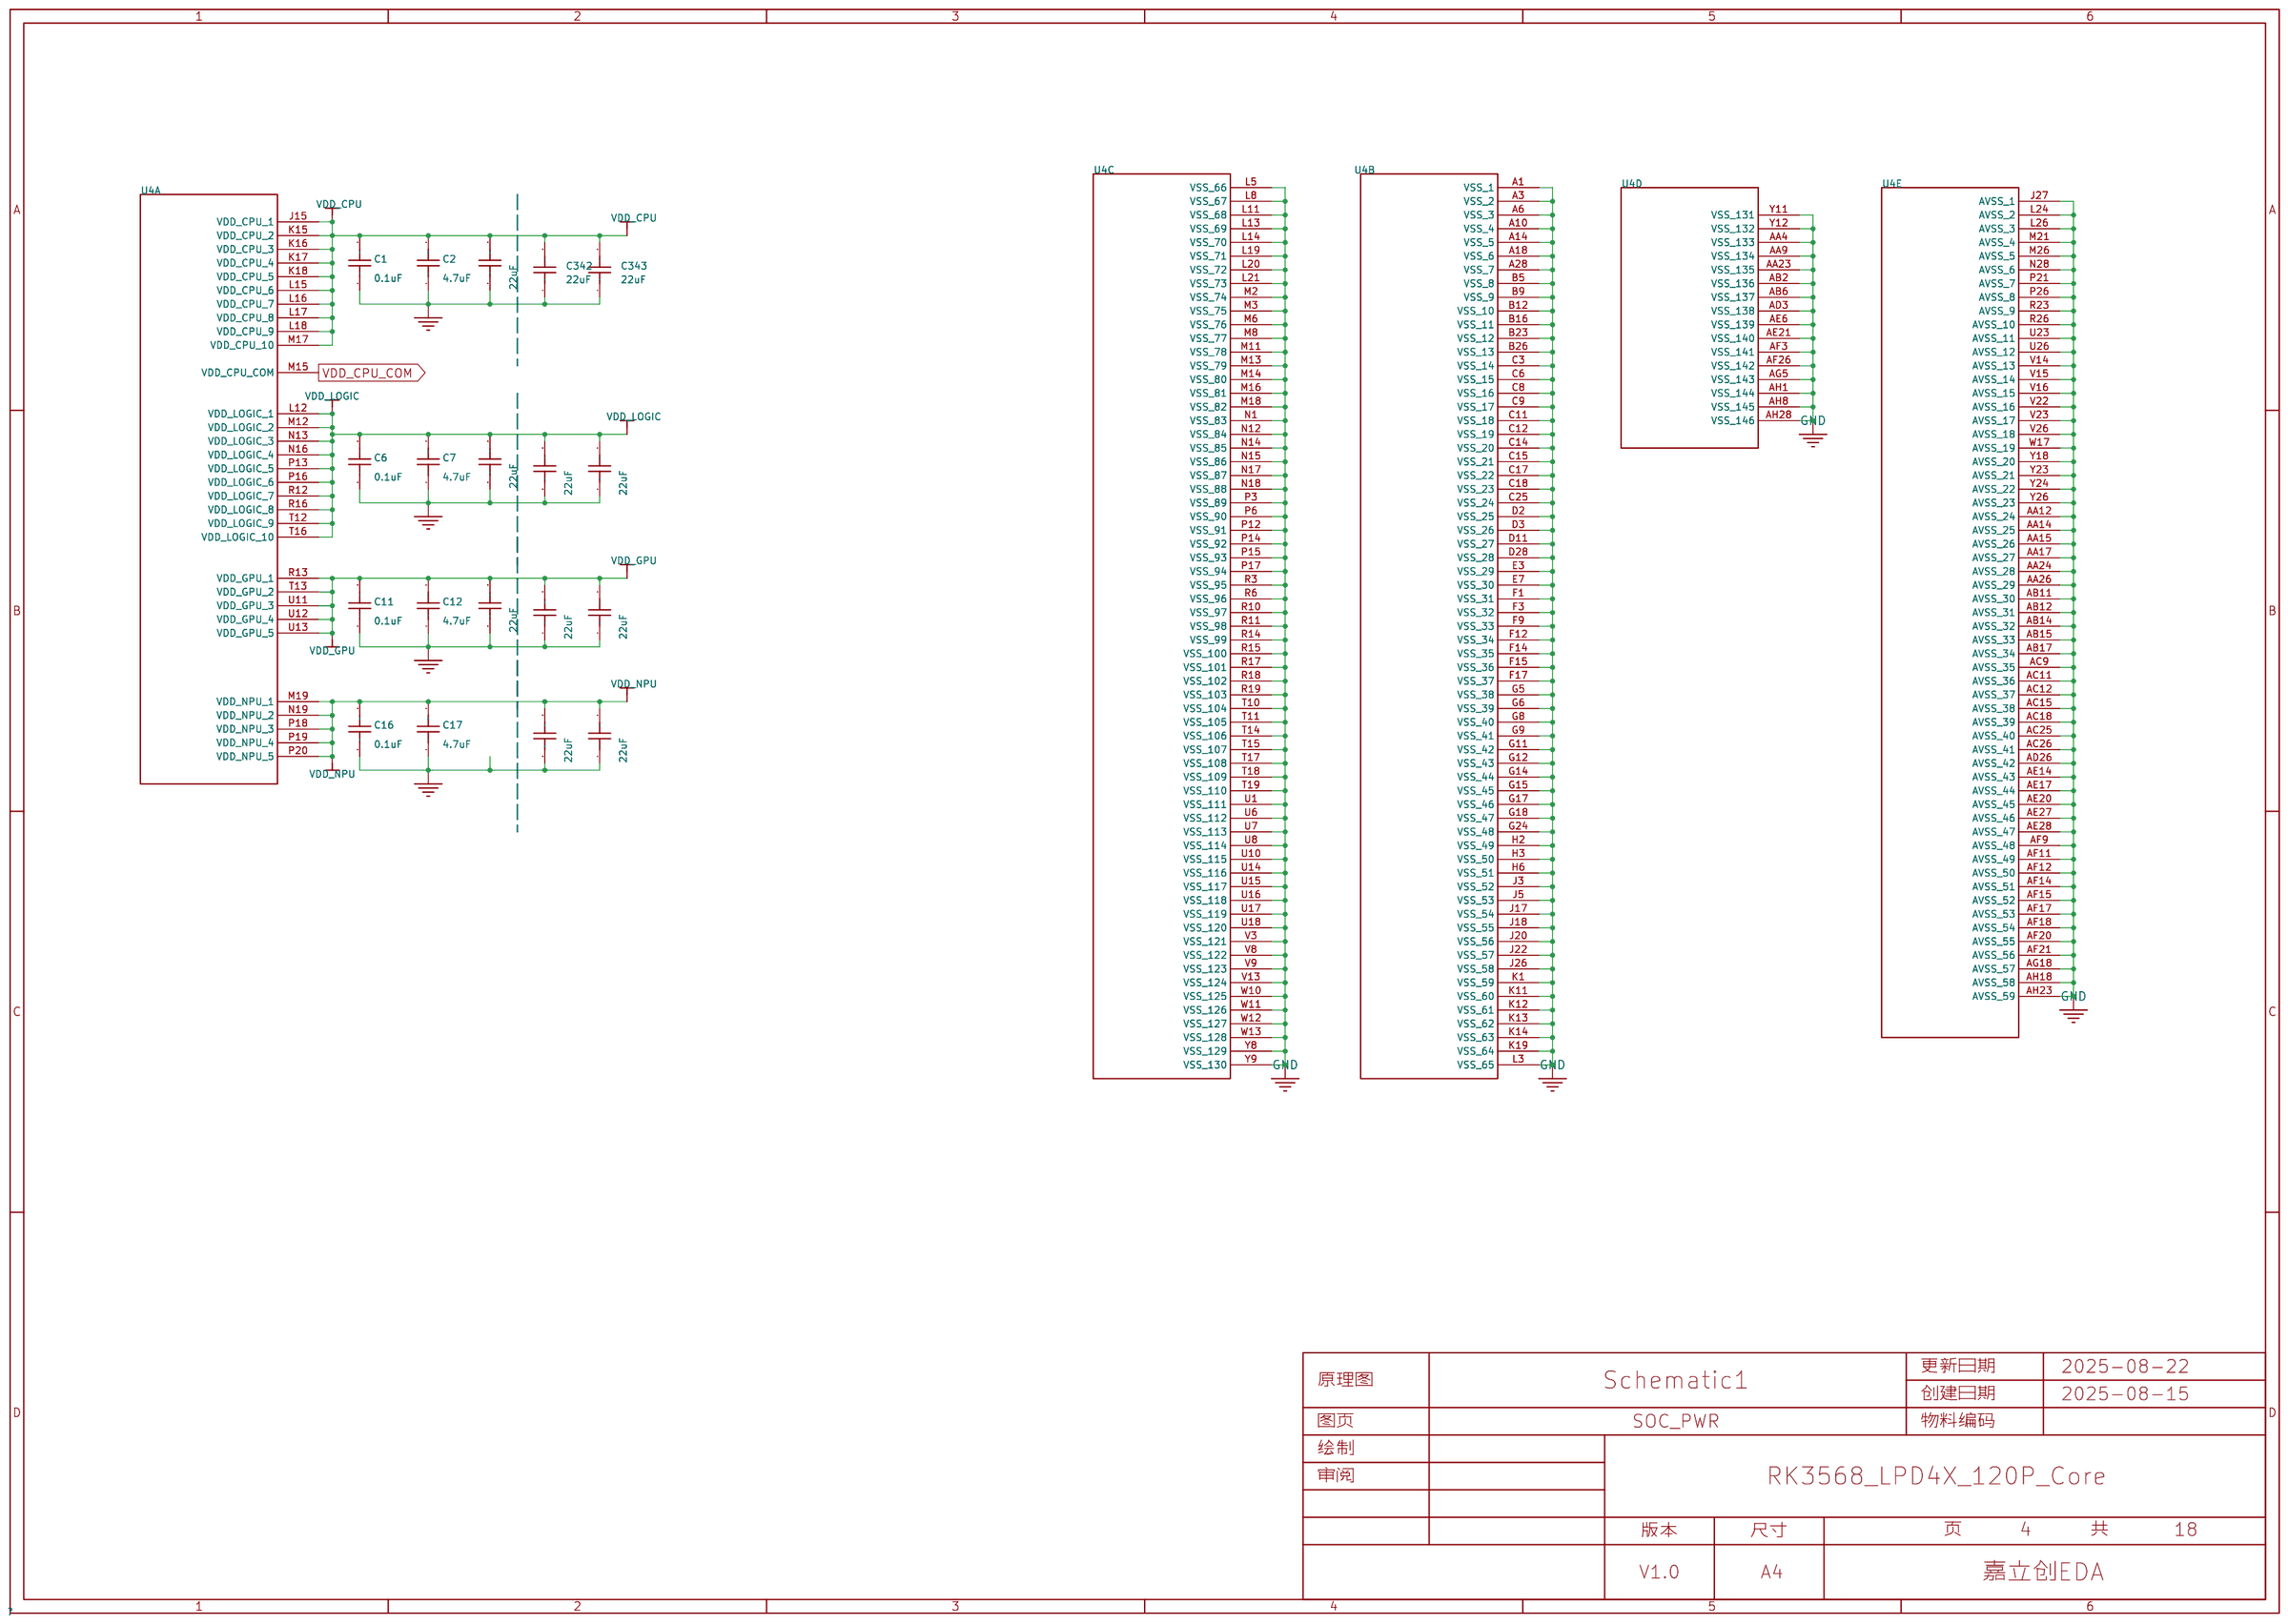
[diagram p9: SOC_PWR]
11 IO资源引出: Create Date: 2026-03-04; Page Name: IO资源引出; Project Name: rk3568B2; Update Date: 2026-03-06
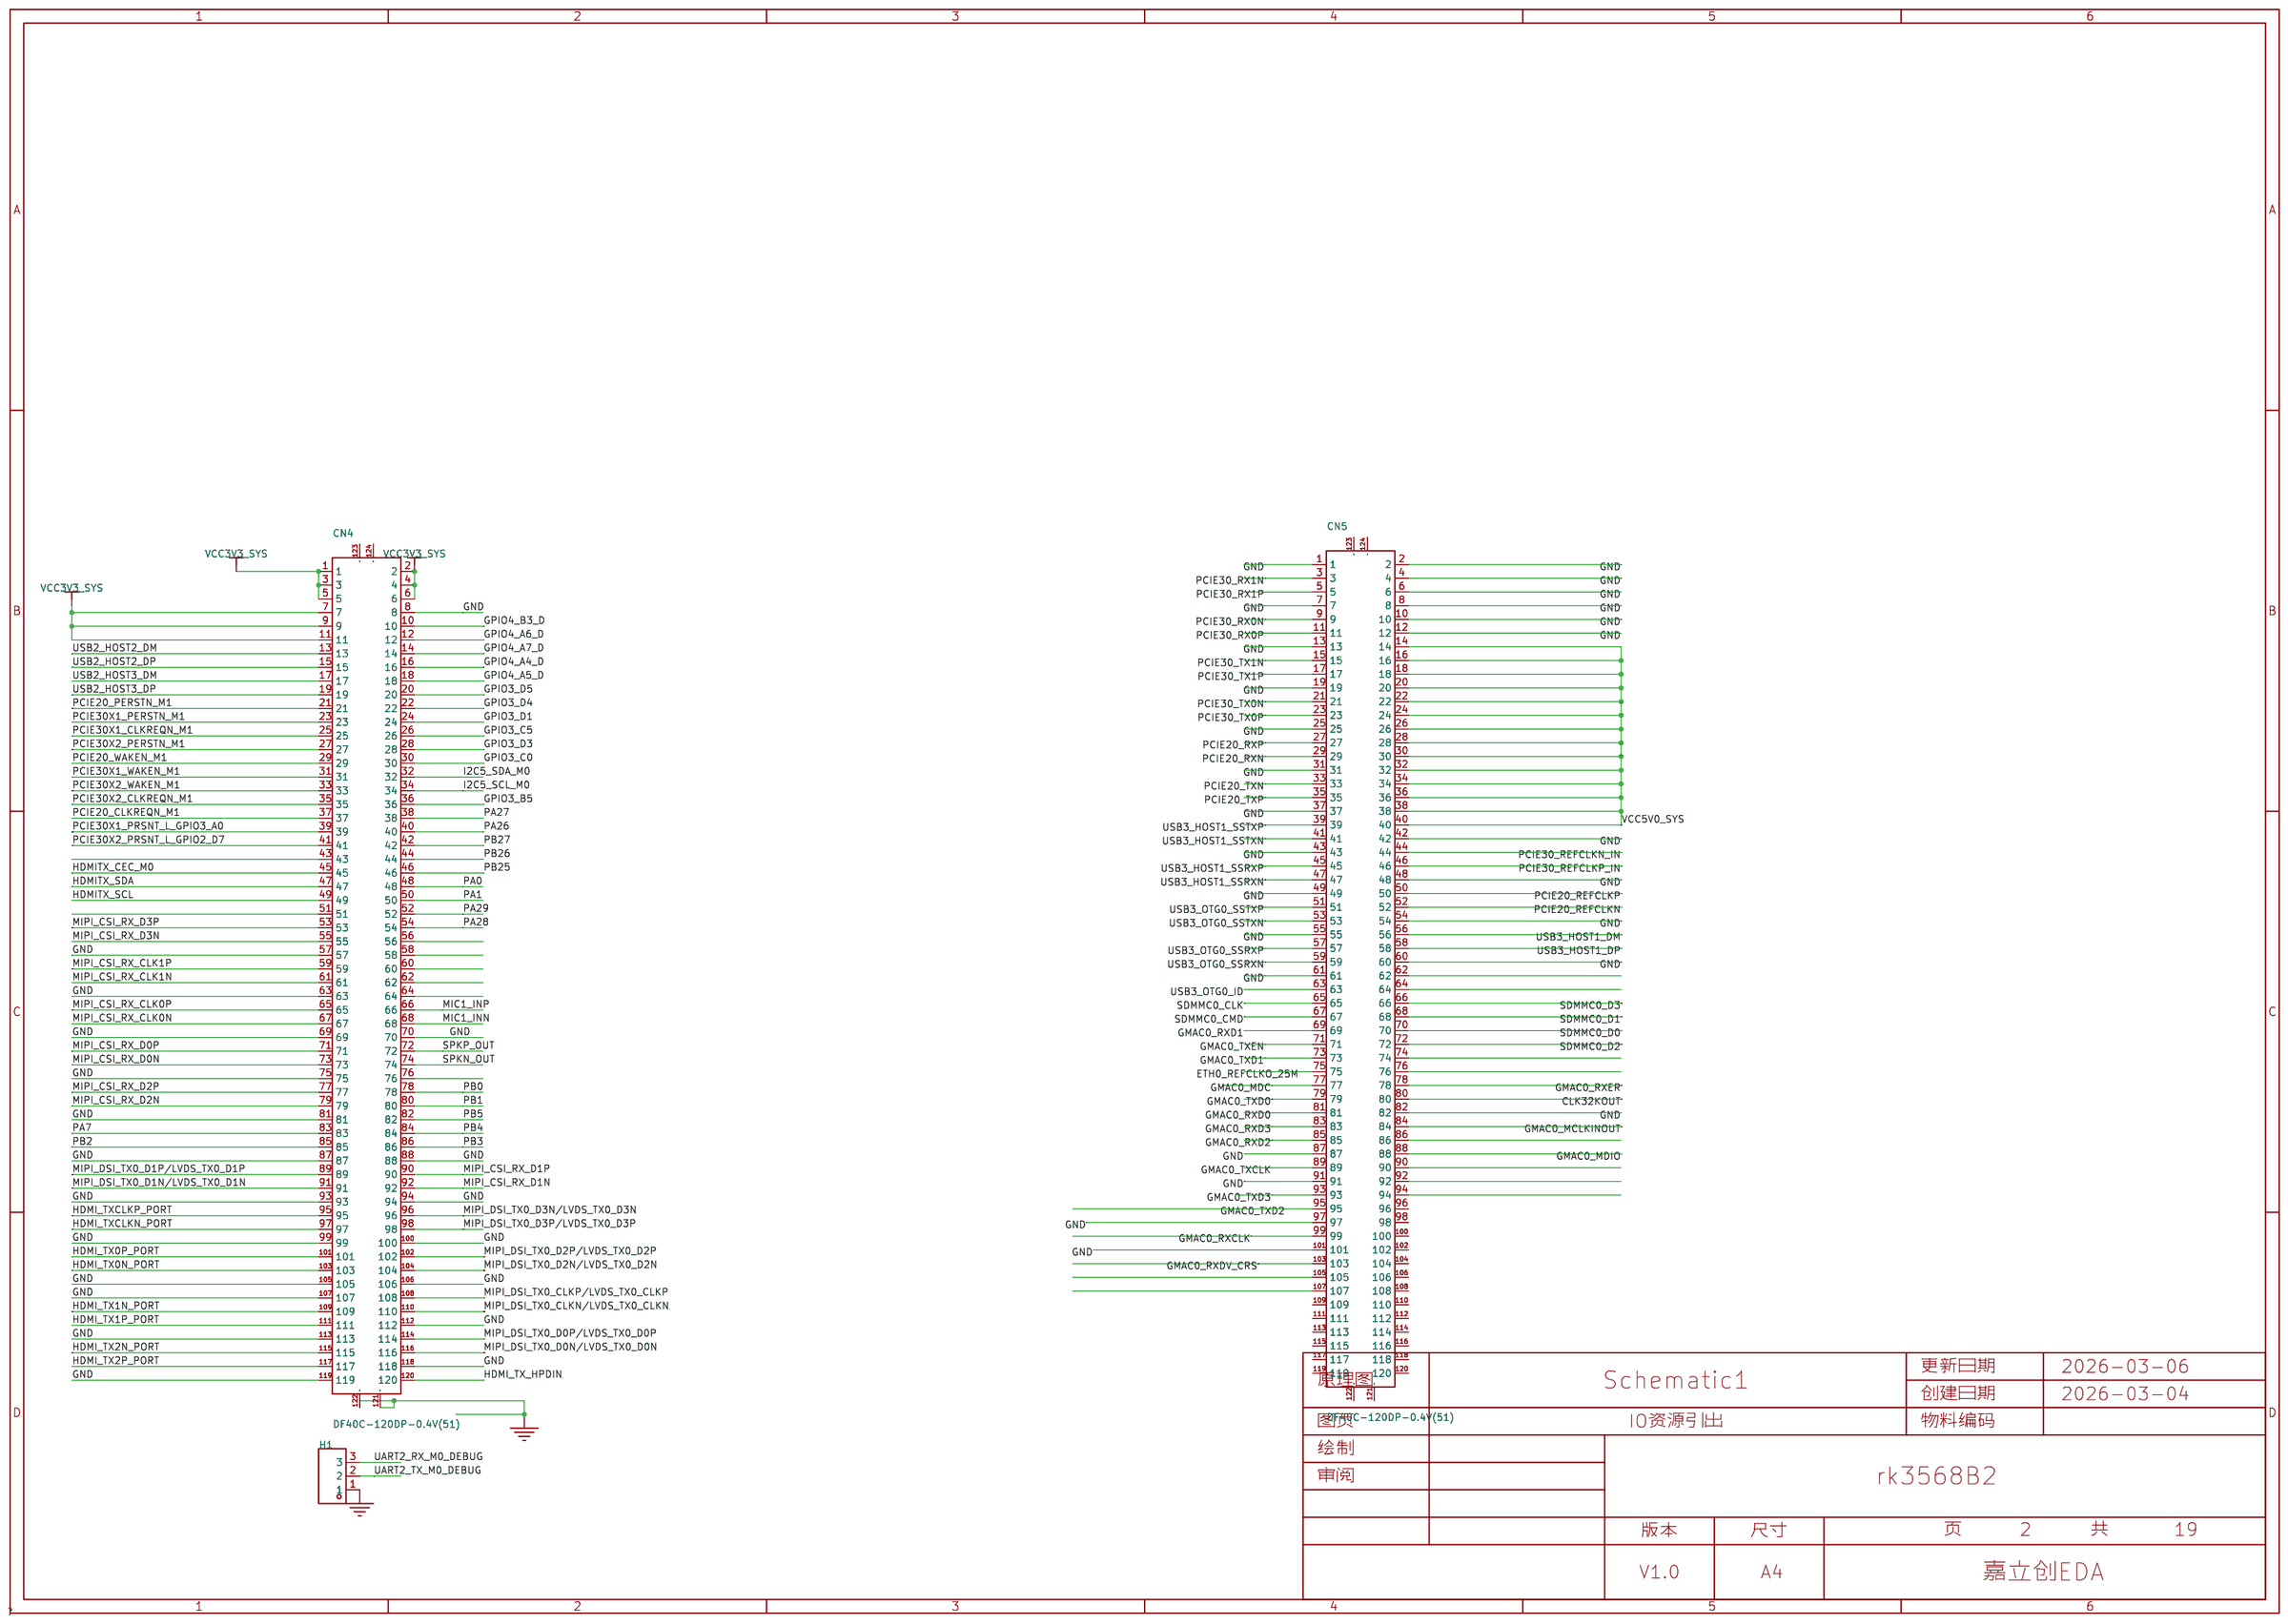
[diagram p10: IO资源引出]
12 DCDC: Create Date: 2026-03-04; Page Name: DCDC; Project Name: rk3568B2; Update Date: 2026-03-04
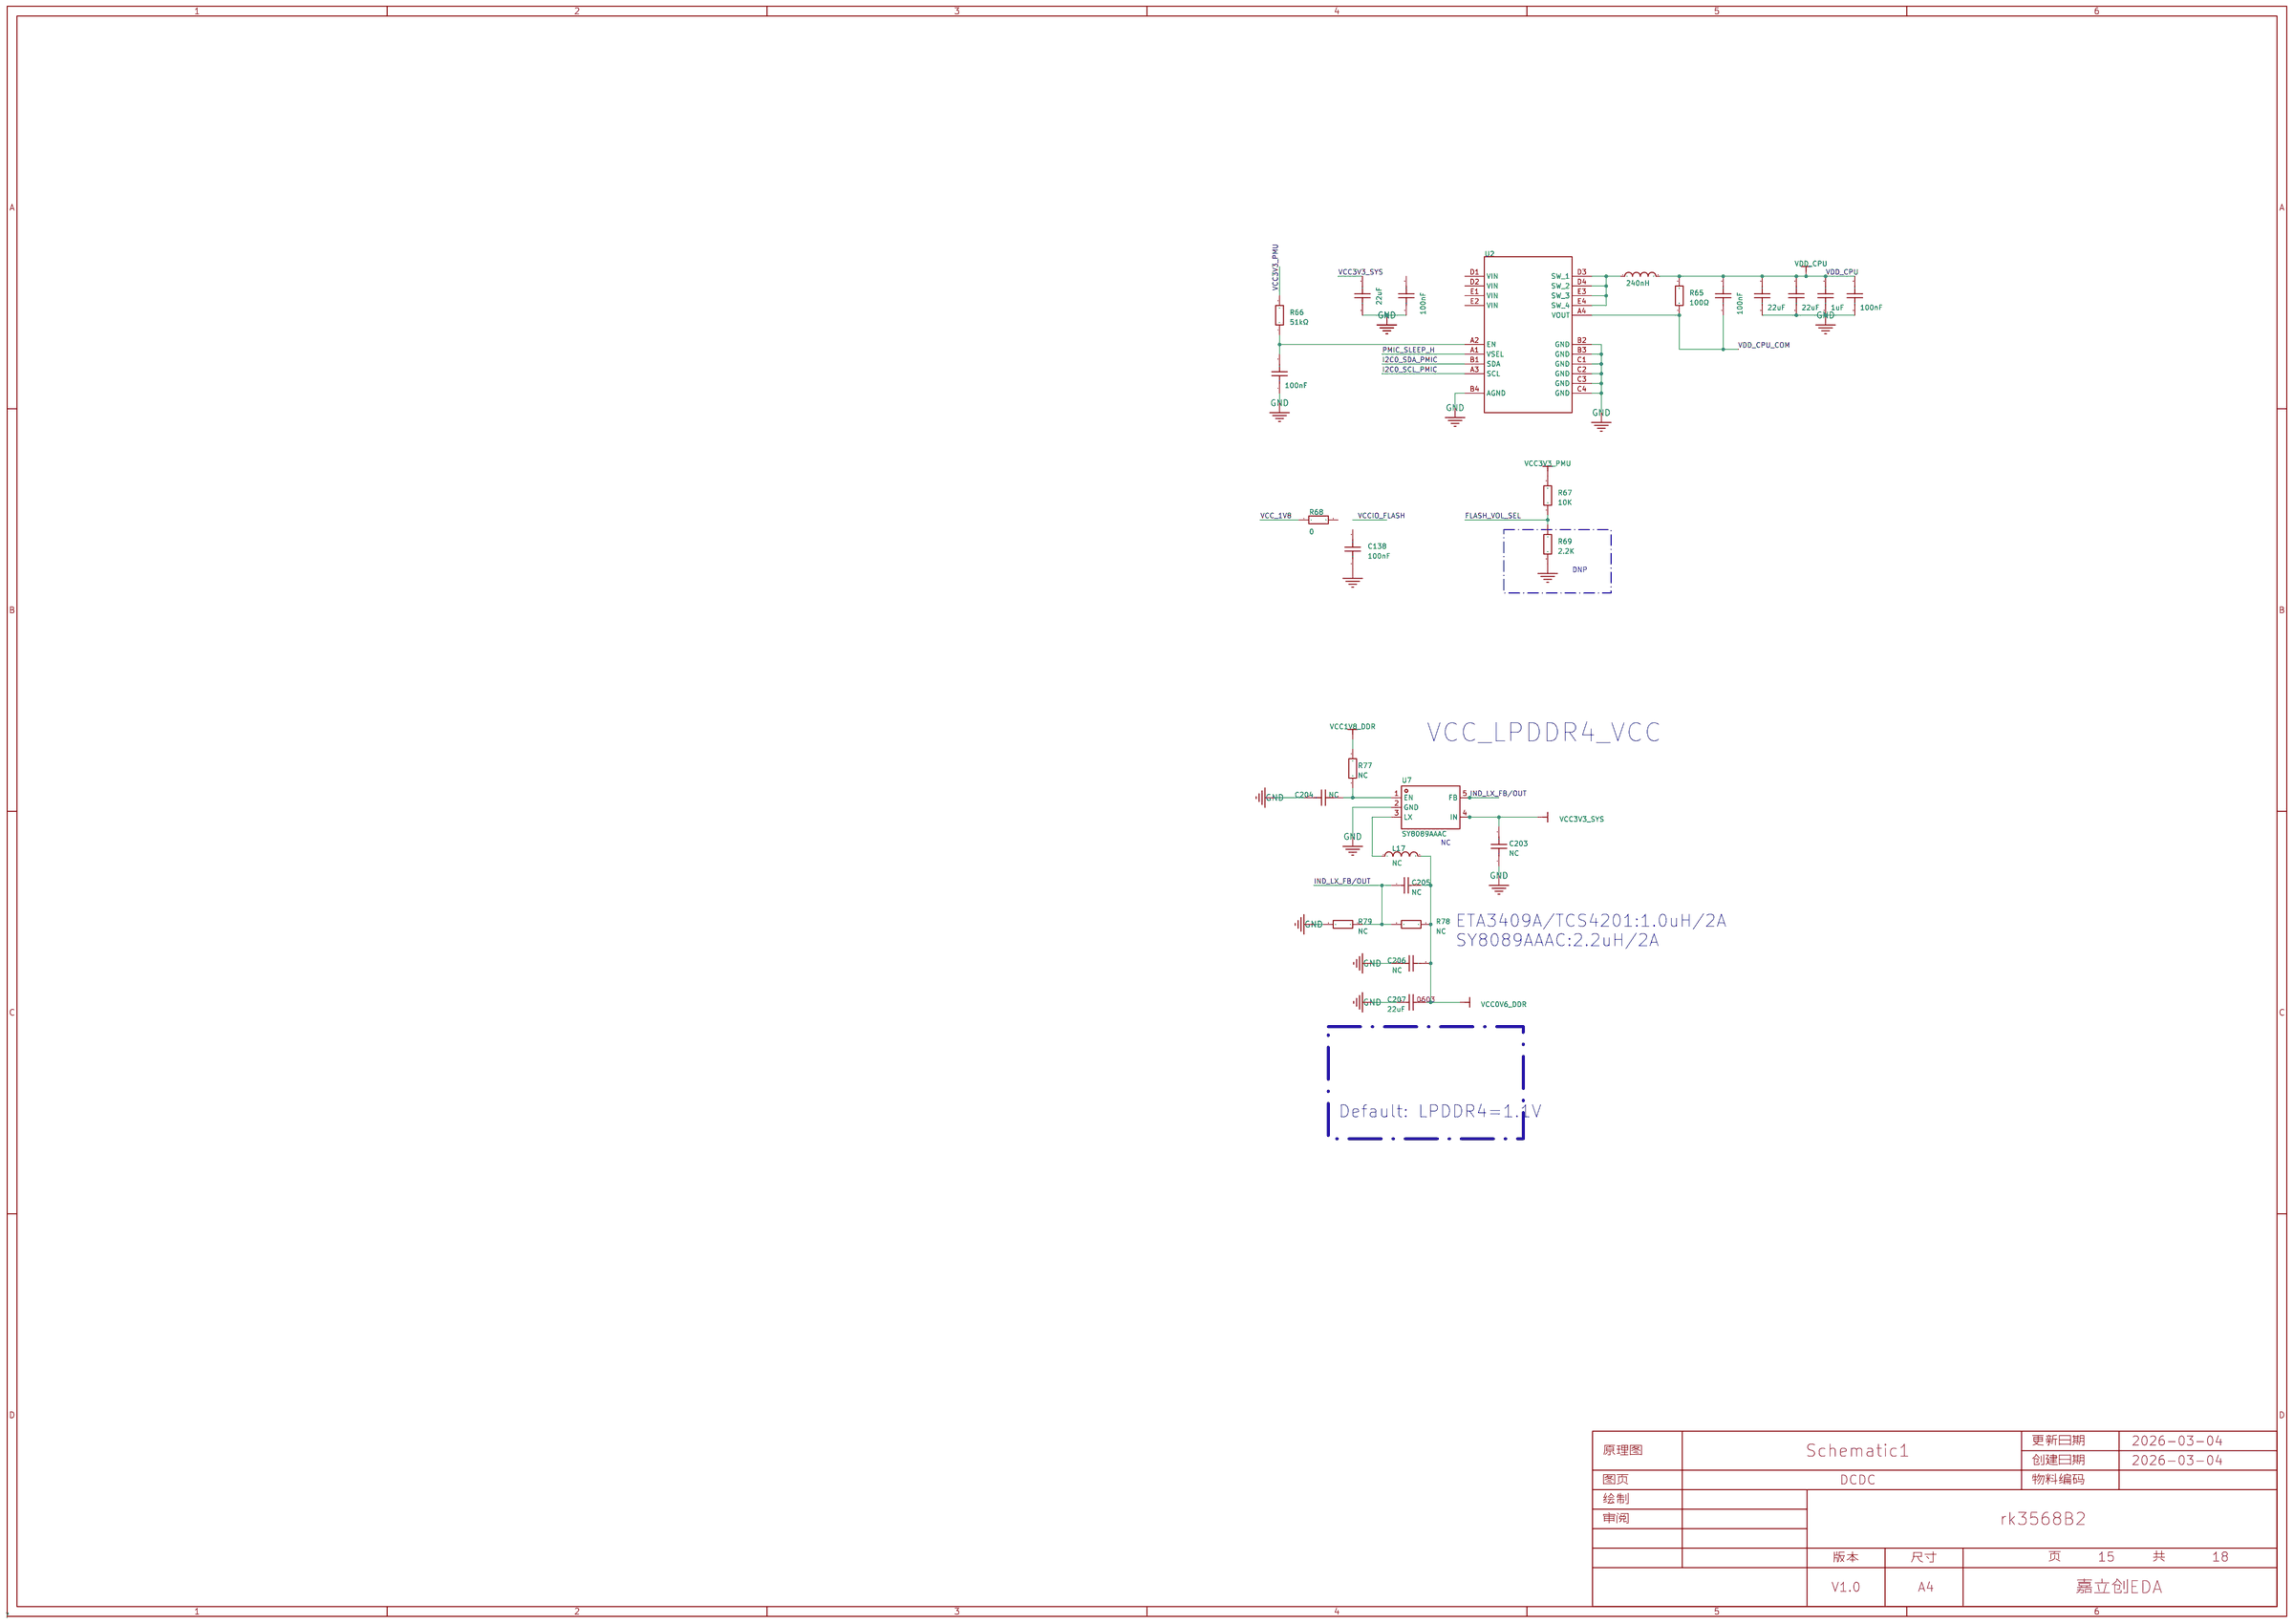
[diagram p11: DCDC]

## Parts
sheet DCDC
C130  22uF  [c0603-nsk]
C131  100nF  [c0402-nsk]
C132  100nF  [c0402-nsk]
C133  22uF  [c0402-nsk]
C134  22uF  [c0603-nsk]
C135  1uF  [c0402-nsk]
C136  100nF  [c0402-nsk]
C137  100nF  [c0402-nsk]
C138  100nF  [C0603]
C203  NC  [R0603_1]
C204  NC  [R0402_2]
C205  NC  [R0402_2]
C206  NC  [R0603_1]
C207  22uF  [C0603_2]
L13  240nH  [IND-SMD_L2.5-W2.0_WPN252012H]
L17  NC  [IND-SMD_L3.0-W3.0]
R65  100Ω  [R0402]
R66  51kΩ  [R0402]
R67  10K  [R0201]
R68  0  [R0603]
R69  2.2K  [R0201]
R77  NC  [R0402_2]
R78  NC  [R0402_2]
R79  NC  [R0402_2]
U2  -  [TCS4525]
U7  NC  [SOT-23-5_L3.0-W1.7-P0.95-LS2.8-BR]
sheet EMMC
C184  100nF  [c0402-nsk]
C185  4.7uF  [c0402-nsk]
C186  100nF  [c0402-nsk]
C187  4.7uF  [c0402-nsk]
C188  2.2uF  [c0402-nsk]
C189  100nF  [c0402-nsk]
C190  4.7uF  [c0402-nsk]
C191  100nF  [c0402-nsk]
C192  4.7uF  [c0402-nsk]
C193  100nF  [c0402-nsk]
R73  10K  [R0402]
R74  10K  [R0402]
R75  10K  [R0402]
R76  47K  [R0402]
U3  -  [fbga-153_l13.0-w11.5-p0.50_klmag1jetd-b041]
sheet IO资源引出
CN4  DF40C-120DP-0.4V(51)  [CONN-SMD_120P-P0.40_DF40C-120DP-0.4V-51]
CN5  DF40C-120DP-0.4V(51)  [CONN-SMD_120P-P0.40_DF40C-120DP-0.4V-51]
H1  -  [HDR-TH_3P-P2.54-V-M_1]
sheet SOC_CAM
C68  100nF  [C0201]
C69  100nF  [C0201]
sheet SOC_COMPHY/USB
C37  100nF  [C0201]
C38  100nF  [C0201]
C39  100nF  [C0201]
C40  100nF  [C0201]
C41  100nF  [C0201]
C42  100nF  [C0201]
C43  100nF  [C0201]
C44  100nF  [C0201]
C45  4.7uF  [c0402-nsk]
C46  100nF  [C0201]
C47  4.7uF  [c0402-nsk]
C48  100nF  [C0201]
C49  100nF  [C0201]
C50  4.7uF  [c0402-nsk]
C51  4.7uF  [c0402-nsk]
R12  200  [R0201]
sheet SOC_DDR
R8  120Ω  [r0402-nsk]
sheet SOC_DISPLAY
C58  100nF  [C0201]
C60  0.1uF  [C0201]
C61  1uF  [C0201]
C63  0.1uF  [C0201]
C64  0.1uF  [C0201]
C66  0.1uF  [C0201]
R32  1.62K  [R0201]
sheet SOC_LOGIC
C20  12pF  [c0402-nsk]
C21  100nF  [C0201]
C22  12pF  [c0402-nsk]
C23  100nF  [C0201]
C24  1uF  [c0402-nsk]
C25  100nF  [C0201]
C26  1uF  [c0402-nsk]
C27  100nF  [C0201]
C28  1uF  [C0402]
C29  100nF  [C0201]
C30  100nF  [C0201]
C31  1uF  [c0402-nsk]
C32  100nF  [C0201]
C33  100nF  [C0201]
C34  1uF  [c0402-nsk]
R1  22R  [R0402]
R2  0Ω  [r0402-nsk]
R3  1M  [R0402]
R169  2K  [R0402]
R170  2K  [R0402]
U1  24MHz  [CRYSTAL-SMD_4P-L3.2-W2.5-BL]
sheet SOC_MAC/SAR/I2S
C52  100nF  [C0201]
C53  100nF  [C0201]
C54  1nF  [C0201]
C56  100nF  [C0201]
C57  100nF  [C0201]
GND1  -  [Test-Point-0.5mm]
R13  22  [R0201]
R14  22  [R0201]
R15  22  [R0201]
R16  22  [R0201]
R17  22  [R0201]
R18  22  [R0201]
R19  4.7K  [R0201]
R20  22  [R0201]
R21  22  [R0201]
R22  10K  [R0201]
R23  100  [R0201]
REC  -  [Test-Point-0.5mm]
sheet SOC_PWR
C1  0.1uF  [C0201]
C2  4.7uF  [C0201]
C3  22uF  [c0402-nsk]
C6  0.1uF  [C0201]
C7  4.7uF  [C0201]
C8  22uF  [c0402-nsk]
C9  22uF  [c0402-nsk]
C10  22uF  [c0402-nsk]
C11  0.1uF  [C0201]
C12  4.7uF  [C0201]
C13  22uF  [c0402-nsk]
C14  22uF  [c0402-nsk]
C15  22uF  [c0402-nsk]
C16  0.1uF  [C0201]
C17  4.7uF  [C0201]
C18  22uF  [c0402-nsk]
C19  22uF  [c0402-nsk]
C342  22uF  [C0603]
C343  22uF  [C0603]
U4  -  [BGA-636_L19.0-W19.0-P0.65-BL]  (sections A,B,C,D,E,F,G,H,I,J,K,L,M,N,O,P,Q,R,S,T,U,V,W)
sheet SOC_SOUND
C72  0.1uF  [C0201]

## Library data of the parts
C130 C133 C134 C207 = CL10A226MQ8NRNC: LCSC Part Name: 22uF ±20% 6.3V; Supplier Part: C59461; Manufacturer: SAMSUNG(三星); Supplier Footprint: 0603; JLCPCB Part Class: Basic Part; Datasheet: https://atta.szlcsc.com/upload/public/pdf/source/20160218/1457707763339.pdf; Supplier: LCSC; Tolerance: ±20%; Voltage Rated: 6.3V; Temperature Coefficient: X5R
C3 C8-C10 C13-C15 C18 C19 C31 C131 C132 C136 C137 C184 C186 C189 C191 = CC0603KRX7R9BB104: LCSC Part Name: 100nF ±10% 50V; Supplier Part: C14663; Manufacturer: YAGEO(国巨); Supplier Footprint: 0603; JLCPCB Part Class: Basic Part; Datasheet: https://atta.szlcsc.com/upload/public/pdf/source/20180910/C282072_33301C7F631E79921B82A8DAC6BCC5B3.pdf; Supplier: LCSC; Tolerance: ±10%; Voltage Rated: 50V; Temperature Coefficient: X7R
C24 C26 C34 C45 C47 C50 C51 C135 = CL10A105KB8NNNC: LCSC Part Name: 1uF ±10% 50V; Supplier Part: C15849; Manufacturer: SAMSUNG(三星); Supplier Footprint: 0603; JLCPCB Part Class: Basic Part; Datasheet: https://atta.szlcsc.com/upload/public/pdf/source/20160103/1457707679084.pdf; Supplier: LCSC; Tolerance: ±10%; Voltage Rated: 50V; Temperature Coefficient: X5R
C138 C342 C343 = CAP_0603: Supplier Footprint: 0603
C203 C206 = 0603X106M100CT: LCSC Part Name: 10uF ±20% 10V; Manufacturer: Walsin(华新科); Supplier Footprint: 0603; JLCPCB Part Class: 扩展库; Datasheet: https://atta.szlcsc.com/upload/public/pdf/source/20161226/1482720147964.pdf; Supplier: LCSC; Tolerance: ±20%; Voltage Rated: 10V; Temperature Coefficient: X5R
C204 = CL05B104KB54PNC: LCSC Part Name: 100nF ±10% 50V; Manufacturer: SAMSUNG(三星); Supplier Footprint: 0402; JLCPCB Part Class: Basic Part; Datasheet: https://atta.szlcsc.com/upload/public/pdf/source/20181009/C307331_222F7C870FD3EA5F46F538B483443886.pdf; Supplier: LCSC; Tolerance: ±10%; Voltage Rated: 50V; Temperature Coefficient: X7R
C205 = 0402CG101J500NT: LCSC Part Name: 100pF ±5% 50V; Manufacturer: FH(风华); Supplier Footprint: 0402; JLCPCB Part Class: Basic Part; Datasheet: https://atta.szlcsc.com/upload/public/pdf/source/20170923/C1546_1506149265265988353.pdf; Supplier: LCSC; Tolerance: ±5%; Voltage Rated: 50V; Temperature Coefficient: C0G
L13 = WPN252012HR24MT: LCSC Part Name: 240nH ±20%; Supplier Part: C305274; Manufacturer: Sunlord(顺络); Supplier Footprint: SMD,2.5x2.0x1.2mm; JLCPCB Part Class: Extended Part; Supplier: LCSC
L17 = SWPA3015S2R2MT: LCSC Part Name: 2.2uH ±20% 2A; Manufacturer: Sunlord(顺络); Supplier Footprint: SMD; JLCPCB Part Class: Extended Part; Datasheet: https://atta.szlcsc.com/upload/public/pdf/source/20210916/AC798BA7E846B7D0B6818F45CD84DB0B.pdf; Supplier: LCSC; Tolerance: ±20%; Rated Current: 2A
R1 R3 R65 R66 R73-R76 R169 R170 = Res_0402: Supplier Footprint: 0402
R12-R23 R32 R67 R69 = Res_0201: Supplier Footprint: 0201
R68 = Res_0603: Supplier Footprint: 0603
R77 = 0402WGF2002TCE: LCSC Part Name: 20kΩ ±1% 62.5mW; Manufacturer: UNI-ROYAL(厚声); Supplier Footprint: 0402; JLCPCB Part Class: Basic Part; Datasheet: https://atta.szlcsc.com/upload/public/pdf/source/20200306/C422600_1E6D84923E4A46A82E41ADD87F860B5C.pdf; Supplier: LCSC; Type: 厚膜电阻; Tolerance: ±1%; Power(Watts): 62.5mW; Temperature Coefficient: ±100ppm/℃; Overload Voltage (Max): 50V; Operating Temperature Range: -55℃~+155℃
R78 = 0402WGF2001TCE: LCSC Part Name: 2kΩ ±1% 62.5mW; Manufacturer: UNI-ROYAL(厚声); Supplier Footprint: 0402; JLCPCB Part Class: Basic Part; Datasheet: https://atta.szlcsc.com/upload/public/pdf/source/20200306/C422600_1E6D84923E4A46A82E41ADD87F860B5C.pdf; Supplier: LCSC; Type: 厚膜电阻; Tolerance: ±1%; Power(Watts): 62.5mW; Temperature Coefficient: ±100ppm/℃; Overload Voltage (Max): 50V; Operating Temperature Range: -55℃~+155℃
R79 = 0402WGF1003TCE: LCSC Part Name: 100kΩ ±1% 62.5mW; Manufacturer: UNI-ROYAL(厚声); Supplier Footprint: 0402; JLCPCB Part Class: Basic Part; Datasheet: https://atta.szlcsc.com/upload/public/pdf/source/20200306/C422600_1E6D84923E4A46A82E41ADD87F860B5C.pdf; Supplier: LCSC; Type: 厚膜电阻; Tolerance: ±1%; Power(Watts): 62.5mW; Temperature Coefficient: ±100ppm/℃; Overload Voltage (Max): 50V; Operating Temperature Range: -55℃~+155℃
U2 = TCS4525_WT: Check: false
U7 = SY8089AAAC: LCSC Part Name: 降压型; Supplier Part: C78988; Manufacturer: silergy(矽力杰); Supplier Footprint: SOT-23-5; JLCPCB Part Class: Extended Part; Datasheet: https://atta.szlcsc.com/upload/public/pdf/source/20210826/394049C81A2AF57A190C26FDBC282657.pdf; Supplier: LCSC; Function: 降压型
C185 C187 C190 C192 C193 = CL10A475KO8NNNC: LCSC Part Name: 4.7uF ±10% 16V; Supplier Part: C19666; Manufacturer: SAMSUNG(三星); Supplier Footprint: 0603; JLCPCB Part Class: Basic Part; Datasheet: https://atta.szlcsc.com/upload/public/pdf/source/20160103/1457707703134.pdf; Supplier: LCSC; Tolerance: ±10%; Voltage Rated: 16V; Temperature Coefficient: X5R
C188 = CL10A225KO8NNNC: LCSC Part Name: 2.2uF ±10% 16V; Supplier Part: C23630; Manufacturer: SAMSUNG(三星); Supplier Footprint: 0603; JLCPCB Part Class: Basic Part; Datasheet: https://atta.szlcsc.com/upload/public/pdf/source/20160103/1457707709512.pdf; Supplier: LCSC; Tolerance: ±10%; Voltage Rated: 16V; Temperature Coefficient: X5R
U3 = EMMC BGA153: Pin Type: IN; Supplier: LCSC; Supplier Part: C577446; Manufacturer: Kingston(金士顿); Manufacturer Part: EMMC04G-M627-A01
CN4 CN5 = DF40C-120DP-0.4V(51): PIN总数:120P;间距:0.4mm;安装方式:立贴;排数:2;额定电流:300mA;工作温度:-35℃~+85℃;; LCSC Part Name: PIN:120P 间距:0.4mm 立贴; Supplier Part: C22426477; Manufacturer: HRS(广濑); Supplier Footprint: SMD,P=0.4mm; JLCPCB Part Class: 扩展库; Datasheet: https://item.szlcsc.com/datasheet/DF40C-120DP-0.4V(51)/24050121.html; Supplier: LCSC; Number of Pins: 120P; Pitch: 0.4mm; Mounting Type: 立贴; Number of Rows: 2; Current Rating: 300mA; Voltage Rating: 30V; Connection Type: 槽型对接; Contact Material: 磷青铜; Contact Plating: 金; Operating Temperature: -35℃~+85℃
H1 = HDR-M_2.54_1x3P_1: Supplier Part: C2937625; Supplier Footprint: 插件
C1 C2 C6 C7 C11 C12 C16 C17 C21 C23 C25 C27 C29 C30 C32 C33 C37-C44 C46 C48 C49 C52-C54 C56-C58 C60 C61 C63 C64 C66 C68 C69 C72 = GRM035R60J475ME15D: LCSC Part Name: 4.7uF ±20% 6.3V; Supplier Part: C335103; Manufacturer: muRata(村田); Supplier Footprint: 0201; JLCPCB Part Class: Extended Part; Datasheet: https://item.szlcsc.com/datasheet/GRM035R60J475ME15D/313624.html; Supplier: LCSC; Tolerance: ±20%; Voltage Rating: 6.3V; Temperature Coefficient: X5R
R8 = 0402WGF1200TCE: LCSC Part Name: 厚膜电阻 120Ω ±1% 62.5mW; Supplier Part: C25079; Manufacturer: UNI-ROYAL(厚声); Supplier Footprint: 0402; JLCPCB Part Class: Basic Part; Datasheet: https://atta.szlcsc.com/upload/public/pdf/source/20200306/C422600_1E6D84923E4A46A82E41ADD87F860B5C.pdf; Supplier: LCSC; Type: 厚膜电阻; Tolerance: ±1%; Power(Watts): 62.5mW; Temperature Coefficient: ±100ppm/℃; Overload Voltage (Max): 50V; Operating Temperature Range: -55℃~+155℃
C20 C22 = CL10C120JB8NNNC: LCSC Part Name: 12pF ±5% 50V; Supplier Part: C38523; Manufacturer: SAMSUNG(三星); Supplier Footprint: 0603; JLCPCB Part Class: Basic Part; Datasheet: https://atta.szlcsc.com/upload/public/pdf/source/20160218/1457707763339.pdf; Supplier: LCSC; Tolerance: ±5%; Voltage Rated: 50V; Temperature Coefficient: C0G
C28 = CL05B104KB54PNC: LCSC Part Name: 100nF ±10% 50V; Supplier Part: C307331; Manufacturer: SAMSUNG(三星); Supplier Footprint: 0402; JLCPCB Part Class: Basic Part; Datasheet: https://atta.szlcsc.com/upload/public/pdf/source/20181009/C307331_222F7C870FD3EA5F46F538B483443886.pdf; Supplier: LCSC; Tolerance: ±10%; Voltage Rated: 50V; Temperature Coefficient: X7R
R2 = 0402WGF0000TCE: LCSC Part Name: 0Ω ±1% 62.5mW; Supplier Part: C17168; Manufacturer: UNI-ROYAL(厚声); Supplier Footprint: 0402; JLCPCB Part Class: Basic Part; Datasheet: https://atta.szlcsc.com/upload/public/pdf/source/20200306/C422600_1E6D84923E4A46A82E41ADD87F860B5C.pdf; Supplier: LCSC; Type: 厚膜电阻; Tolerance: ±1%; Power(Watts): 62.5mW; Temperature Coefficient: ±800ppm/℃; Overload Voltage (Max): 50V; Operating Temperature Range: -55℃~+155℃
U1 = 3225 24M 12PF 10PPM: LCSC Part Name: 24MHz ±10ppm 12pF; Supplier Part: C5181479; Manufacturer: SST(索斯特); Supplier Footprint: SMD3225-4P; JLCPCB Part Class: 扩展库; Datasheet: https://atta.szlcsc.com/upload/public/pdf/source/20220927/6DE882D78314C64B49594C58A0BA2E52.pdf; Supplier: LCSC; Normal temperature Frequency Tolerance: ±10ppm; External load capacitor: 12pF; Frequency Stability(Full temperature range): ±30ppm; Operating Temperature: -20℃~+70℃
GND1 REC = Test-Point
U4 = RK3568

## Nets
GND: C1.1 C2.1 C3.1 C6.1 C7.1 C8.1 C9.1 C10.1 C11.1 C12.1 C13.1 C14.1 C15.1 C16.1 C17.1 C18.1 C19.1 C20.2 C21.1 C22.1 C23.1 C24.1 C25.1 C26.1 C27.1 C28.1 C29.1 C30.1 C31.1 C32.1 C33.2 C34.1 C37.1 C38.1 C39.1 C40.1 C41.1 C42.1 C43.1 C44.1 C45.1 C46.1 C47.1 C48.1 C49.1 C50.1 C51.1 C52.1 C53.1 C54.1 C56.1 C57.1 C58.1 C60.1 C61.1 C63.1 C64.1 C66.1 C68.1 C69.1 C72.1 C130.1 C131.1 C133.1 C134.1 C135.1 C136.1 C137.1 C138.1 C184.2 C185.2 C186.1 C187.1 C188.1 C189.1 C190.1 C191.1 C192.1 C193.1 C203.1 C204.2 C206.2 C207.2 C342.1 C343.1 CN4.8 CN4.57 CN4.63 CN4.69 CN4.70 CN4.75 CN4.81 CN4.87 CN4.88 CN4.93 CN4.94 CN4.99 CN4.100 CN4.105 CN4.106 CN4.107 CN4.112 CN4.113 CN4.118 CN4.119 CN4.121 CN4.122 CN5.1 CN5.2 CN5.4 CN5.6 CN5.7 CN5.8 CN5.10 CN5.12 CN5.13 CN5.19 CN5.25 CN5.31 CN5.37 CN5.42 CN5.43 CN5.48 CN5.49 CN5.54 CN5.55 CN5.60 CN5.61 CN5.82 CN5.87 CN5.91 CN5.97 CN5.101 GND1.1 H1.1 R12.2 R19.2 R32.2 R69.1 R76.1 R79.2 U1.2(GND) U1.4(GND) U2.B2(GND) U2.B3(GND) U2.B4(AGND) U2.C1(GND) U2.C2(GND) U2.C3(GND) U2.C4(GND) U3.A6(VSS) U3.C4(VSSQ) U3.E7(VSS) U3.G5(VSS) U3.H10(VSS) U3.J5(VSS) U3.K8(VSS) U3.N2(VSSQ) U3.N5(VSSQ) U3.P4(VSSQ) U3.P6(VSSQ) U4.A1(VSS_1) U4.A3(VSS_2) U4.A6(VSS_3) U4.A10(VSS_4) U4.A14(VSS_5) U4.A18(VSS_6) U4.A28(VSS_7) U4.AA4(VSS_133) U4.AA9(VSS_134) U4.AA12(AVSS_24) U4.AA14(AVSS_25) U4.AA15(AVSS_26) U4.AA17(AVSS_27) U4.AA23(VSS_135) U4.AA24(AVSS_28) U4.AA26(AVSS_29) U4.AB2(VSS_136) U4.AB6(VSS_137) U4.AB11(AVSS_30) U4.AB12(AVSS_31) U4.AB14(AVSS_32) U4.AB15(AVSS_33) U4.AB17(AVSS_34) U4.AB24(TVSS) U4.AC9(AVSS_35) U4.AC11(AVSS_36) U4.AC12(AVSS_37) U4.AC15(AVSS_38) U4.AC18(AVSS_39) U4.AC25(AVSS_40) U4.AC26(AVSS_41) U4.AD3(VSS_138) U4.AD26(AVSS_42) U4.AE6(VSS_139) U4.AE14(AVSS_43) U4.AE17(AVSS_44) U4.AE20(AVSS_45) U4.AE21(VSS_140) U4.AE27(AVSS_46) U4.AE28(AVSS_47) U4.AF3(VSS_141) U4.AF9(AVSS_48) U4.AF11(AVSS_49) U4.AF12(AVSS_50) U4.AF14(AVSS_51) U4.AF15(AVSS_52) U4.AF17(AVSS_53) U4.AF18(AVSS_54) U4.AF20(AVSS_55) U4.AF21(AVSS_56) U4.AF26(VSS_142) U4.AG5(VSS_143) U4.AG18(AVSS_57) U4.AH1(VSS_144) U4.AH8(VSS_145) U4.AH18(AVSS_58) U4.AH23(AVSS_59) U4.AH28(VSS_146) U4.B5(VSS_8) U4.B9(VSS_9) U4.B12(VSS_10) U4.B16(VSS_11) U4.B23(VSS_12) U4.B26(VSS_13) U4.C3(VSS_14) U4.C6(VSS_15) U4.C8(VSS_16) U4.C9(VSS_17) U4.C11(VSS_18) U4.C12(VSS_19) U4.C14(VSS_20) U4.C15(VSS_21) U4.C17(VSS_22) U4.C18(VSS_23) U4.C25(VSS_24) U4.D2(VSS_25) U4.D3(VSS_26) U4.D11(VSS_27) U4.D28(VSS_28) U4.E3(VSS_29) U4.E7(VSS_30) U4.F1(VSS_31) U4.F3(VSS_32) U4.F9(VSS_33) U4.F12(VSS_34) U4.F14(VSS_35) U4.F15(VSS_36) U4.F17(VSS_37) U4.G5(VSS_38) U4.G6(VSS_39) U4.G8(VSS_40) U4.G9(VSS_41) U4.G11(VSS_42) U4.G12(VSS_43) U4.G14(VSS_44) U4.G15(VSS_45) U4.G17(VSS_46) U4.G18(VSS_47) U4.G24(VSS_48) U4.H2(VSS_49) U4.H3(VSS_50) U4.H6(VSS_51) U4.J3(VSS_52) U4.J5(VSS_53) U4.J8(DDR_AVSS) U4.J17(VSS_54) U4.J18(VSS_55) U4.J20(VSS_56) U4.J22(VSS_57) U4.J26(VSS_58) U4.J27(AVSS_1) U4.K1(VSS_59) U4.K11(VSS_60) U4.K12(VSS_61) U4.K13(VSS_62) U4.K14(VSS_63) U4.K19(VSS_64) U4.L3(VSS_65) U4.L5(VSS_66) U4.L8(VSS_67) U4.L11(VSS_68) U4.L13(VSS_69) U4.L14(VSS_70) U4.L19(VSS_71) U4.L20(VSS_72) U4.L21(VSS_73) U4.L24(AVSS_2) U4.L26(AVSS_3) U4.M2(VSS_74) U4.M3(VSS_75) U4.M6(VSS_76) U4.M8(VSS_77) U4.M11(VSS_78) U4.M13(VSS_79) U4.M14(VSS_80) U4.M16(VSS_81) U4.M18(VSS_82) U4.M20(EDP_TX_AVDD_0V9) U4.M21(AVSS_4) U4.M22(EDP_TX_AVDD_1V8) U4.M26(AVSS_5) U4.N1(VSS_83) U4.N11(SYSPLL_AVSS) U4.N12(VSS_84) U4.N14(VSS_85) U4.N15(VSS_86) U4.N17(VSS_87) U4.N18(VSS_88) U4.N28(AVSS_6) U4.P3(VSS_89) U4.P6(VSS_90) U4.P12(VSS_91) U4.P14(VSS_92) U4.P15(VSS_93) U4.P17(VSS_94) U4.P21(AVSS_7) U4.P26(AVSS_8) U4.R3(VSS_95) U4.R6(VSS_96) U4.R10(VSS_97) U4.R11(VSS_98) U4.R14(VSS_99) U4.R15(VSS_100) U4.R17(VSS_101) U4.R18(VSS_102) U4.R19(VSS_103) U4.R23(AVSS_9) U4.R26(AVSS_10) U4.T10(VSS_104) U4.T11(VSS_105) U4.T14(VSS_106) U4.T15(VSS_107) U4.T17(VSS_108) U4.T18(VSS_109) U4.T19(VSS_110) U4.U1(VSS_111) U4.U6(VSS_112) U4.U7(VSS_113) U4.U8(VSS_114) U4.U10(VSS_115) U4.U14(VSS_116) U4.U15(VSS_117) U4.U16(VSS_118) U4.U17(VSS_119) U4.U18(VSS_120) U4.U23(AVSS_11) U4.U26(AVSS_12) U4.V3(VSS_121) U4.V8(VSS_122) U4.V9(VSS_123) U4.V13(VSS_124) U4.V14(AVSS_13) U4.V15(AVSS_14) U4.V16(AVSS_15) U4.V20(PMUPLL_AVSS) U4.V22(AVSS_16) U4.V23(AVSS_17) U4.V26(AVSS_18) U4.W10(VSS_125) U4.W11(VSS_126) U4.W12(VSS_127) U4.W13(VSS_128) U4.W15(MIPI_DSI_TX1_AVDD_0V9) U4.W17(AVSS_19) U4.Y8(VSS_129) U4.Y9(VSS_130) U4.Y11(VSS_131) U4.Y12(VSS_132) U4.Y15(MIPI_DSI_TX1_AVDD_1V8) U4.Y18(AVSS_20) U4.Y23(AVSS_21) U4.Y24(AVSS_22) U4.Y26(AVSS_23) U7.2(GND) ; also on sheet 13 14 15 17 18 19
VCC0V6_DDR: C205.2 C206.1 C207.1 L17.2 R78.1 U4.J11(DDRPHY_VDDQL_1) U4.J12(DDRPHY_VDDQL_2) U4.J14(DDRPHY_VDDQL_3) U4.K10(DDRPHY_VDDQL_4) U4.L10(DDRPHY_VDDQL_5) U4.M10(DDRPHY_VDDQL_6) ; also on sheet 13
VCC1V8_DDR: R77.2 ; also on sheet 13
VCC3V3_PMU: C23.2 C30.2 R66.2 R67.2 R169.2 R170.2 U4.W19(PMUIO2) U4.Y20(PMUIO1) ; also on sheet 14
VCC3V3_SD: C189.2 C190.2 C191.2 C192.2 U3.E6(VCC) U3.F5(VCC) U3.J10(VCC) U3.K9(VCC) ; also on sheet 14
VCC3V3_SYS: C130.2 C131.2 C203.2 CN4.1 CN4.2 CN4.3 CN4.4 CN4.5 CN4.6 CN4.7 CN4.9 CN4.11 U2.D1(VIN) U2.D2(VIN) U2.E1(VIN) U2.E2(VIN) U7.4(IN) ; also on sheet 14 18 19
VCC5V0_SYS: CN5.14 CN5.16 CN5.18 CN5.20 CN5.22 CN5.24 CN5.26 CN5.28 CN5.30 CN5.32 CN5.34 CN5.36 CN5.38 CN5.40 ; also on sheet 14 18
VCC_1V8: C57.2 R68.1 U4.H20(OTP_VCC18) ; also on sheet 14 17
VCC_3V3: C38.2 C41.2 C52.2 U4.M23(USB3_AVDD_3V3) U4.P10(USB2_AVDD_3V3) U4.V12(VCCIO7) ; also on sheet 14 17
VCC_DDR: R8.2 U4.H9(DDRPHY_VDDQ_1) U4.H11(DDRPHY_VDDQ_2) U4.H12(DDRPHY_VDDQ_3) U4.H14(DDRPHY_VDDQ_4) U4.H15(DDRPHY_VDDQ_5) U4.J9(DDRPHY_VDDQ_6) U4.L9(DDRPHY_VDDQ_7) U4.M9(DDRPHY_VDDQ_8) ; also on sheet 13 14
VCCA1V8_IMAGE: C63.2 U4.W18(HDMI_TX_AVDD_1V8) ; also on sheet 14
VCCA1V8_PMU: C26.2 C27.2 U4.Y21(PMUPLL_AVDD_1V8) ; also on sheet 13 14
VCCA_1V8: C31.2 C32.2 C46.2 C47.2 C48.2 C50.2 C56.2 R22.1 U4.H22(SARADC_AVDD_1V8) U4.N10(SYSPLL_AVDD_1V8) U4.R22(MULTI_PHY_AVDD_1V8) U4.U22(PCIE30_AVDD_1V8) ; also on sheet 14
VCCIO_ACODEC: C72.2 U4.H17(VCCIO1) ; also on sheet 14
VCCIO_FLASH: C138.2 C184.1 C185.1 C186.2 C187.2 R68.2 R73.2 R74.1 R75.1 U3.C6(VCCQ) U3.M4(VCCQ) U3.N4(VCCQ) U3.P3(VCCQ) U3.P5(VCCQ) ; also on sheet 15
VCCIO_WL: C53.2 U4.J21(VCCIO4) ; also on sheet 14
VDD_CPU: C1.2 C2.2 C3.2 C132.2 C133.2 C134.2 C135.2 C136.2 C342.2 C343.2 L13.2 R65.2 U4.J15(VDD_CPU_1) U4.K15(VDD_CPU_2) U4.K16(VDD_CPU_3) U4.K17(VDD_CPU_4) U4.K18(VDD_CPU_5) U4.L15(VDD_CPU_6) U4.L16(VDD_CPU_7) U4.L17(VDD_CPU_8) U4.L18(VDD_CPU_9) U4.M17(VDD_CPU_10)
VDD_CPU_COM: C132.1 R65.1 U2.A4(VOUT) U4.M15(VDD_CPU_COM)
VDD_GPU: C11.2 C12.2 C13.2 C14.2 C15.2 U4.R13(VDD_GPU_1) U4.T13(VDD_GPU_2) U4.U11(VDD_GPU_3) U4.U12(VDD_GPU_4) U4.U13(VDD_GPU_5) ; also on sheet 14
VDD_LOGIC: C6.2 C7.2 C8.2 C9.2 C10.2 U4.L12(VDD_LOGIC_1) U4.M12(VDD_LOGIC_2) U4.N13(VDD_LOGIC_3) U4.N16(VDD_LOGIC_4) U4.P13(VDD_LOGIC_5) U4.P16(VDD_LOGIC_6) U4.R12(VDD_LOGIC_7) U4.R16(VDD_LOGIC_8) U4.T12(VDD_LOGIC_9) U4.T16(VDD_LOGIC_10) ; also on sheet 14
VDD_NPU: C16.2 C17.2 C18.2 C19.2 U4.M19(VDD_NPU_1) U4.N19(VDD_NPU_2) U4.P18(VDD_NPU_3) U4.P19(VDD_NPU_4) U4.P20(VDD_NPU_5) ; also on sheet 14
VDDA0V9_IMAGE: C60.2 C61.2 U4.V17(HDMI_TX_AVDD_0V9_1) U4.V18(HDMI_TX_AVDD_0V9_2) ; also on sheet 14
VDDA0V9_PMU: C24.2 C25.2 C33.1 C34.2 U4.V19(PMU_VDD_LOGIC_0V9) U4.V21(PMUPLL_AVDD_0V9) ; also on sheet 14
VDDA_0V9: C28.2 C29.2 C44.2 C45.2 C49.2 C51.2 U4.P11(SYSPLL_AVDD_0V9) U4.R20(MULTI_PHY_AVDD_0V9_1) U4.R21(MULTI_PHY_AVDD_0V9_2) U4.U20(PCIE30_AVDD_0V9_2) U4.U21(PCIE30_AVDD_0V9_1) ; also on sheet 14
4G_DISABLE_GPIO4_C2: U4.AF8(GPIO4_C2_D)
4G_PWREN_H_GPIO0_D5: U4.AD25(GPIO0_D5_D)
BT_REG_ON_H_GPIO0_C1: U4.AF23(GPIO0_C1_D)
BT_WAKE_HOST_H_GPIO0_B7: U4.AH26(GPIO0_B7_D)
CHG_INT_L_GPIO0_C2: U4.AG23(GPIO0_C2_D)
CLK32KOUT: CN5.80 U4.E26(GPIO2_C6_D)
DDR_A0_A: U4.C2(AC11) ; also on sheet 13
DDR_A0_B: U4.B8(AC13) ; also on sheet 13
DDR_A1_A: U4.B1(AC2) ; also on sheet 13
DDR_A1_B: U4.A7(AC6) ; also on sheet 13
DDR_A2_A: U4.E4(AC15) ; also on sheet 13
DDR_A2_B: U4.E11(AC18) ; also on sheet 13
DDR_A3_A: U4.C4(AC12) ; also on sheet 13
DDR_A3_B: U4.D9(AC4) ; also on sheet 13
DDR_A4_A: U4.C5(AC14) ; also on sheet 13
DDR_A4_B: U4.E9(AC19) ; also on sheet 13
DDR_A5_A: U4.D5(AC16) ; also on sheet 13
DDR_A5_B: U4.B7(AC5) ; also on sheet 13
DDR_A_CKE0: U4.B3(AC22) ; also on sheet 13
DDR_A_CKE1: U4.F4(AC3) ; also on sheet 13
DDR_A_CLKN: U4.A4(AC24) ; also on sheet 13
DDR_A_CLKP: U4.B4(AC23) ; also on sheet 13
DDR_A_CS0: U4.A2(AC25) ; also on sheet 13
DDR_A_CS1: U4.B2(AC26) ; also on sheet 13
DDR_A_DQS0N: U4.G2(DDR_DQS0N_A) ; also on sheet 13
DDR_A_DQS0P: U4.G1(DDR_DQS0P_A) ; also on sheet 13
DDR_A_DQS1N: U4.L1(DDR_DQS1N_A) ; also on sheet 13
DDR_A_DQS1P: U4.L2(DDR_DQS1P_A) ; also on sheet 13
DDR_A_ODTCA: U4.C1(AC8) ; also on sheet 13
DDR_B_CKE0: U4.D6(AC10) ; also on sheet 13
DDR_B_CKE1: U4.E6(AC17) ; also on sheet 13
DDR_B_CLKN: U4.A5(AC9) ; also on sheet 13
DDR_B_CLKP: U4.B6(AC0) ; also on sheet 13
DDR_B_CS0: U4.D8(AC28) ; also on sheet 13
DDR_B_CS1: U4.E8(AC27) ; also on sheet 13
DDR_B_DQS0N: U4.B11(DDR_DQS0N_B) ; also on sheet 13
DDR_B_DQS0P: U4.A11(DDR_DQS0P_B) ; also on sheet 13
DDR_B_DQS1N: U4.A15(DDR_DQS1N_B) ; also on sheet 13
DDR_B_DQS1P: U4.B15(DDR_DQS1P_B) ; also on sheet 13
DDR_B_ODTCA: U4.A8(AC7) ; also on sheet 13
DDR_DM0_A: U4.H5(DDR_DM0_A) ; also on sheet 13
DDR_DM0_B: U4.D14(DDR_DM0_B) ; also on sheet 13
DDR_DM1_A: U4.J4(DDR_DM1_A) ; also on sheet 13
DDR_DM1_B: U4.E17(DDR_DM1_B) ; also on sheet 13
DDR_DQ0_A: U4.F2(DDR_DQ0_A) ; also on sheet 13
DDR_DQ0_B: U4.B10(DDR_DQ0_B) ; also on sheet 13
DDR_DQ1_A: U4.E1(DDR_DQ1_A) ; also on sheet 13
DDR_DQ1_B: U4.A9(DDR_DQ1_B) ; also on sheet 13
DDR_DQ2_A: U4.E2(DDR_DQ2_A) ; also on sheet 13
DDR_DQ2_B: U4.D12(DDR_DQ2_B) ; also on sheet 13
DDR_DQ3_A: U4.D1(DDR_DQ3_A) ; also on sheet 13
DDR_DQ3_B: U4.E12(DDR_DQ3_B) ; also on sheet 13
DDR_DQ4_A: U4.J1(DDR_DQ4_A) ; also on sheet 13
DDR_DQ4_B: U4.A12(DDR_DQ4_B) ; also on sheet 13
DDR_DQ5_A: U4.J2(DDR_DQ5_A) ; also on sheet 13
DDR_DQ5_B: U4.D15(DDR_DQ5_B) ; also on sheet 13
DDR_DQ6_A: U4.H1(DDR_DQ6_A) ; also on sheet 13
DDR_DQ6_B: U4.E15(DDR_DQ6_B) ; also on sheet 13
DDR_DQ7_A: U4.H4(DDR_DQ7_A) ; also on sheet 13
DDR_DQ7_B: U4.E14(DDR_DQ7_B) ; also on sheet 13
DDR_DQ8_A: U4.M1(DDR_DQ8_A) ; also on sheet 13
DDR_DQ8_B: U4.A16(DDR_DQ8_B) ; also on sheet 13
DDR_DQ9_A: U4.N2(DDR_DQ9_A) ; also on sheet 13
DDR_DQ9_B: U4.B17(DDR_DQ9_B) ; also on sheet 13
DDR_DQ10_A: U4.L7(DDR_DQ10_A) ; also on sheet 13
DDR_DQ10_B: U4.A17(DDR_DQ10_B) ; also on sheet 13
DDR_DQ11_A: U4.L6(DDR_DQ11_A) ; also on sheet 13
DDR_DQ11_B: U4.B18(DDR_DQ11_B) ; also on sheet 13
DDR_DQ12_A: U4.K2(DDR_DQ12_A) ; also on sheet 13
DDR_DQ12_B: U4.B13(DDR_DQ12_B) ; also on sheet 13
DDR_DQ13_A: U4.J6(DDR_DQ13_A) ; also on sheet 13
DDR_DQ13_B: U4.A13(DDR_DQ13_B) ; also on sheet 13
DDR_DQ14_A: U4.J7(DDR_DQ14_A) ; also on sheet 13
DDR_DQ14_B: U4.D17(DDR_DQ14_B) ; also on sheet 13
DDR_DQ15_A: U4.L4(DDR_DQ15_A) ; also on sheet 13
DDR_DQ15_B: U4.B14(DDR_DQ15_B) ; also on sheet 13
DDR_RESET: U4.F11(AC29) ; also on sheet 13
DVP_PWREN0_H_GPIO0_D3: U4.AE26(GPIO0_D3_D)
EMMC_CLKOUT/FLASH_DQS: U3.M6(CLK) ; also on sheet 15
EMMC_CMD/FLASH_WRN: R75.2 U3.M5(CMD) ; also on sheet 15
EMMC_D0/FLASH_D0: R73.1 U3.A3(DAT0) ; also on sheet 15
EMMC_D1/FLASH_D1: U3.A4(DAT1) ; also on sheet 15
EMMC_D2/FLASH_D2: U3.A5(DAT2) ; also on sheet 15
EMMC_D3/FLASH_D3: U3.B2(DAT3) ; also on sheet 15
EMMC_D4/FLASH_D4: U3.B3(DAT4) ; also on sheet 15
EMMC_D5/FLASH_D5: U3.B4(DAT5) ; also on sheet 15
EMMC_D6/FLASH_D6: U3.B5(DAT6) ; also on sheet 15
EMMC_D7/FLASH_D7: U3.B6(DAT7) ; also on sheet 15
EMMC_DATA_STROBE/FLASH_CLE: R76.2 U3.H5(DS) ; also on sheet 15
EMMC_RSTN/FSPI_D2/FLASH_WPN: C193.2 R74.2 U3.K5(RST_n) ; also on sheet 15
ETH0_REFCLKO_25M: CN5.75 R20.2
FLASH_VOL_SEL: R67.1 R69.2 U4.AG25(GPIO0_A7_U)
GMAC0_MCLKINOUT: CN5.84 U4.F25(GPIO2_C2_D)
GMAC0_MDC: CN5.77 R21.2
GMAC0_MDIO: CN5.88 U4.H23(GPIO2_C4_D)
GMAC0_RXCLK: CN5.99 U4.B28(GPIO2_A5_U)
GMAC0_RXD0: CN5.81 U4.F27(GPIO2_B6_U)
GMAC0_RXD1: CN5.69 U4.H25(GPIO2_B7_D)
GMAC0_RXD2: CN5.85 U4.E27(GPIO2_A3_U)
GMAC0_RXD3: CN5.83 U4.E28(GPIO2_A4_U)
GMAC0_RXDV_CRS: CN5.103 U4.F24(GPIO2_C0_D)
GMAC0_RXER: CN5.78 U4.F26(GPIO2_C5_D)
GMAC0_TXCLK: CN5.89 R15.2
GMAC0_TXD0: CN5.79 R16.2
GMAC0_TXD1: CN5.73 R17.2
GMAC0_TXD2: CN5.95 R13.2
GMAC0_TXD3: CN5.93 R14.2
GMAC0_TXEN: CN5.71 R18.2 R19.1
GPIO3_B5: CN4.36 ; also on sheet 17
GPIO3_C0: CN4.30 ; also on sheet 17
GPIO3_C5: CN4.26 ; also on sheet 17
GPIO3_D1: CN4.24 ; also on sheet 17
GPIO3_D3: CN4.28 ; also on sheet 17
GPIO3_D4: CN4.22 ; also on sheet 17
GPIO3_D5: CN4.20 ; also on sheet 17
GPIO4_A4_D: CN4.16 ; also on sheet 17
GPIO4_A5_D: CN4.18 ; also on sheet 17
GPIO4_A6_D: CN4.12 ; also on sheet 17
GPIO4_A7_D: CN4.14 ; also on sheet 17
GPIO4_B3_D: CN4.10 ; also on sheet 17
GPIO4_C5: U4.AD8(GPIO4_C5_D)
GPIO4_C6: U4.AE8(GPIO4_C6_D)
HALL_INT_L_GPIO0_C6: U4.AD20(GPIO0_C6_D)
HDMI_TX0N_PORT: CN4.103 U4.AH20(HDMI_TX_D0N)
HDMI_TX0P_PORT: CN4.101 U4.AG20(HDMI_TX_D0P)
HDMI_TX1N_PORT: CN4.109 U4.AH21(HDMI_TX_D1N)
HDMI_TX1P_PORT: CN4.111 U4.AG21(HDMI_TX_D1P)
HDMI_TX2N_PORT: CN4.115 U4.AH22(HDMI_TX_D2N)
HDMI_TX2P_PORT: CN4.117 U4.AG22(HDMI_TX_D2P)
HDMI_TX_HPDIN: C58.2 CN4.120 U4.AB18(HDMI_TX_HPDIN)
HDMI_TXCLKN_PORT: CN4.97 U4.AG19(HDMI_TX_CLKN)
HDMI_TXCLKP_PORT: CN4.95 U4.AH19(HDMI_TX_CLKP)
HDMIRX_INT_L_GPIO4_C3: U4.AA11(GPIO4_C3_D)
HDMIRX_RST_L_GPIO4_D2: U4.AB9(GPIO4_D2_D)
HDMITX_CEC_M0: CN4.45 U4.AH6(GPIO4_D1_U)
HDMITX_SCL: CN4.49 U4.AG8(GPIO4_C7_U)
HDMITX_SDA: CN4.47 U4.AG7(GPIO4_D0_U)
HOST_WAKE_BT_H_GPIO0_B0: U4.AD23(GPIO0_B0_U)
I2C0_SCL_PMIC: R169.1 U2.A3(SCL) U4.AF24(GPIO0_B1_U) ; also on sheet 14
I2C0_SDA_PMIC: R170.1 U2.B1(SDA) U4.AB21(GPIO0_B2_U) ; also on sheet 14
I2C1_SCL_TP: U4.AG24(GPIO0_B3_U)
I2C1_SDA_TP: U4.AB20(GPIO0_B4_U)
I2C3_SCL_M0: U4.E18(GPIO1_A1_U)
I2C3_SDA_M0: U4.D18(GPIO1_A0_U)
I2C5_SCL_M0: CN4.34 ; also on sheet 17
I2C5_SDA_M0: CN4.32 ; also on sheet 17
I2S1_LRCK_TX_M0_RK809: U4.A20(GPIO1_A5_D) ; also on sheet 14
I2S1_MCLK_M0_RK809: U4.A19(GPIO1_A2_D) ; also on sheet 14
I2S1_SCLK_TX_M0_RK809: U4.B19(GPIO1_A3_D) ; also on sheet 14
I2S1_SDI0_M0/PDM_SDI0_M0_RK809: U4.B21(GPIO1_B3_D) ; also on sheet 14
I2S1_SDO0_M0_RK809: U4.B20(GPIO1_A7_D) ; also on sheet 14
IND_LX_FB/OUT: C205.1 R78.2 R79.1 U7.5(FB)
LCD0_BL_PWM4: U4.AE23(GPIO0_C3_D)
LCD0_PWREN_H_GPIO0_C7: U4.AH25(GPIO0_C7_D)
MIC1_INN: CN4.68 ; also on sheet 14
MIC1_INP: CN4.66 ; also on sheet 14
MIPI_AVDD_0V9: C64.2 C68.2 U4.W14(MIPI_CSI_RX_AVDD_0V9) U4.W16(MIPI_DSI_TX0/LVDS_TX0_AVDD_0V9) ; also on sheet 14
MIPI_AVDD_1V8: C66.2 C69.2 U4.Y14(MIPI_CSI_RX_AVDD_1V8) U4.Y17(MIPI_DSI_TX0/LVDS_TX0_AVDD_1V8) ; also on sheet 14
MIPI_CSI_RX_CLK0N: CN4.67 U4.AH10(MIPI_CSI_RX_CLK0N)
MIPI_CSI_RX_CLK0P: CN4.65 U4.AG10(MIPI_CSI_RX_CLK0P)
MIPI_CSI_RX_CLK1N: CN4.61 U4.AH9(MIPI_CSI_RX_CLK1N)
MIPI_CSI_RX_CLK1P: CN4.59 U4.AG9(MIPI_CSI_RX_CLK1P)
MIPI_CSI_RX_D0N: CN4.73 U4.AH12(MIPI_CSI_RX_D0N)
MIPI_CSI_RX_D0P: CN4.71 U4.AG12(MIPI_CSI_RX_D0P)
MIPI_CSI_RX_D1N: CN4.92 U4.AH11(MIPI_CSI_RX_D1N)
MIPI_CSI_RX_D1P: CN4.90 U4.AG11(MIPI_CSI_RX_D1P)
MIPI_CSI_RX_D2N: CN4.79 U4.AD11(MIPI_CSI_RX_D2N)
MIPI_CSI_RX_D2P: CN4.77 U4.AE11(MIPI_CSI_RX_D2P)
MIPI_CSI_RX_D3N: CN4.55 U4.AE9(MIPI_CSI_RX_D3N)
MIPI_CSI_RX_D3P: CN4.53 U4.AD9(MIPI_CSI_RX_D3P)
MIPI_DSI_TX0_CLKN/LVDS_TX0_CLKN: CN4.110 U4.AG15(MIPI_DSI_TX0_CLKN/LVDS_TX0_CLKN)
MIPI_DSI_TX0_CLKP/LVDS_TX0_CLKP: CN4.108 U4.AH15(MIPI_DSI_TX0_CLKP/LVDS_TX0_CLKP)
MIPI_DSI_TX0_D0N/LVDS_TX0_D0N: CN4.116 U4.AG17(MIPI_DSI_TX0_D0N/LVDS_TX0_D0N)
MIPI_DSI_TX0_D0P/LVDS_TX0_D0P: CN4.114 U4.AH17(MIPI_DSI_TX0_D0P/LVDS_TX0_D0P)
MIPI_DSI_TX0_D1N/LVDS_TX0_D1N: CN4.91 U4.AG16(MIPI_DSI_TX0_D1N/LVDS_TX0_D1N)
MIPI_DSI_TX0_D1P/LVDS_TX0_D1P: CN4.89 U4.AH16(MIPI_DSI_TX0_D1P/LVDS_TX0_D1P)
MIPI_DSI_TX0_D2N/LVDS_TX0_D2N: CN4.104 U4.AG14(MIPI_DSI_TX0_D2N/LVDS_TX0_D2N)
MIPI_DSI_TX0_D2P/LVDS_TX0_D2P: CN4.102 U4.AH14(MIPI_DSI_TX0_D2P/LVDS_TX0_D2P)
MIPI_DSI_TX0_D3N/LVDS_TX0_D3N: CN4.96 U4.AG13(MIPI_DSI_TX0_D3N/LVDS_TX0_D3N)
MIPI_DSI_TX0_D3P/LVDS_TX0_D3P: CN4.98 U4.AH13(MIPI_DSI_TX0_D3P/LVDS_TX0_D3P)
PA0: CN4.48 ; also on sheet 19
PA1: CN4.50 ; also on sheet 19
PA7: CN4.83 ; also on sheet 19
PA26: CN4.40 ; also on sheet 19
PA27: CN4.38 ; also on sheet 19
PA28: CN4.54 ; also on sheet 19
PA29: CN4.52 ; also on sheet 19
PB0: CN4.78 ; also on sheet 19
PB1: CN4.80 ; also on sheet 19
PB2: CN4.85 ; also on sheet 19
PB3: CN4.86 ; also on sheet 19
PB4: CN4.84 ; also on sheet 19
PB5: CN4.82 ; also on sheet 19
PB25: CN4.46 ; also on sheet 19
PB26: CN4.44 ; also on sheet 19
PB27: CN4.42 ; also on sheet 19
PCIE20_CLKREQN_M1: CN4.37 ; also on sheet 17
PCIE20_PERSTN_M1: CN4.21 ; also on sheet 17
PCIE20_REFCLKN: CN5.52 U4.V25(PCIE20_REFCLKN)
PCIE20_REFCLKP: CN5.50 U4.V24(PCIE20_REFCLKP)
PCIE20_RXN: CN5.29 U4.Y28(PCIE20_RXN/SATA2_RXN/QSGMII_RXN_M1)
PCIE20_RXP: CN5.27 U4.Y27(PCIE20_RXP/SATA2_RXP/QSGMII_RXP_M1)
PCIE20_TXN: CN5.33 U4.W28(PCIE20_TXN/SATA2_TXN/QSGMII_TXN_M1)
PCIE20_TXP: CN5.35 U4.W27(PCIE20_TXP/SATA2_TXP/QSGMII_TXP_M1)
PCIE20_WAKEN_M1: CN4.29 ; also on sheet 17
PCIE30_REFCLKN_IN: CN5.44 U4.AA25(PCIE30_REFCLKN_IN)
PCIE30_REFCLKP_IN: CN5.46 U4.Y25(PCIE30_REFCLKP_IN)
PCIE30_RX0N: CN5.9 U4.AC27(PCIE30_RX0N)
PCIE30_RX0P: CN5.11 U4.AC28(PCIE30_RX0P)
PCIE30_RX1N: CN5.3 U4.AD27(PCIE30_RX1N)
PCIE30_RX1P: CN5.5 U4.AD28(PCIE30_RX1P)
PCIE30_TX0N: CN5.21 U4.AA27(PCIE30_TX0N)
PCIE30_TX0P: CN5.23 U4.AA28(PCIE30_TX0P)
PCIE30_TX1N: CN5.15 U4.AB27(PCIE30_TX1N)
PCIE30_TX1P: CN5.17 U4.AB28(PCIE30_TX1P)
PCIE30X1_CLKREQN_M1: CN4.25 ; also on sheet 17
PCIE30X1_PERSTN_M1: CN4.23 ; also on sheet 17
PCIE30X1_PRSNT_L_GPIO3_A0: CN4.39 ; also on sheet 17
PCIE30X1_WAKEN_M1: CN4.31 ; also on sheet 17
PCIE30X2_CLKREQN_M1: CN4.35 ; also on sheet 17
PCIE30X2_PERSTN_M1: CN4.27 ; also on sheet 17
PCIE30X2_PRSNT_L_GPIO2_D7: CN4.41 ; also on sheet 17
PCIE30X2_WAKEN_M1: CN4.33 ; also on sheet 17
PCIE_PWREN_H_GPIO0_D4: U4.AB23(GPIO0_D4_D)
PDM_CLK0_M0_RK809: U4.C20(GPIO1_A6_D) ; also on sheet 14
PDM_CLK1_M0_ADC: U4.F18(GPIO1_A4_D)
PDM_SDI1_M0_ADC: U4.A21(GPIO1_B2_D)
PDM_SDI2_M0_ADC: U4.E20(GPIO1_B1_D)
PDM_SDI3_M0_ADC: U4.D20(GPIO1_B0_D)
PMIC_INT_L: U4.AA22(GPIO0_A3_U) ; also on sheet 14
PMIC_SLEEP_H: U2.A1(VSEL) U4.AG28(GPIO0_A2_D) ; also on sheet 14
RESETn: C21.2 R2.2 U4.AH27(NPOR_U)
SARADC_VIN0_KEY/RECOVERY: C54.2 R22.2 R23.1 U4.B27(SARADC_VIN0)
SATA2_ACT_LED: U4.AH7(GPIO4_C4_D)
SDMMC0_CLK: CN5.65 ; also on sheet 15
SDMMC0_CMD: CN5.67 ; also on sheet 15
SDMMC0_D0: CN5.70 ; also on sheet 15
SDMMC0_D1: CN5.68 ; also on sheet 15
SDMMC0_D2: CN5.72 ; also on sheet 15
SDMMC0_D3: CN5.66 ; also on sheet 15
SDMMC0_DET: U4.Y22(GPIO0_A4_U)
SDMMC0_PWREN_L: U4.AF25(GPIO0_A5_D)
SOC_RECOVERY: R23.2 REC.1
SPKN_OUT: CN4.74 ; also on sheet 14
SPKP_OUT: CN4.72 ; also on sheet 14
TP_INT_L_GPIO0_B5: U4.AC22(GPIO0_B5_U)
TP_RST_L_GPIO0_B6: U4.AA20(GPIO0_B6_U)
TSADC_SHUT_M0: R2.1 U4.AG26(GPIO0_A1_Z)
UART2_RX_M0_DEBUG: H1.3 U4.AC20(GPIO0_D0_U)
UART2_TX_M0_DEBUG: H1.2 U4.AH24(GPIO0_D1_U)
USB2_HOST2_DM: CN4.13 U4.R1(USB2_HOST2_DM)
USB2_HOST2_DP: CN4.15 U4.R2(USB2_HOST2_DP)
USB2_HOST3_DM: CN4.17 U4.T1(USB2_HOST3_DM)
USB2_HOST3_DP: CN4.19 U4.T2(USB2_HOST3_DP)
USB3_HOST1_DM: CN5.56 U4.P25(USB3_HOST1_DM)
USB3_HOST1_DP: CN5.58 U4.P24(USB3_HOST1_DP)
USB3_HOST1_SSRXN: CN5.47 U4.U27(USB3_HOST1_SSRXN/SATA1_RXN/QSGMII_RXN_M0)
USB3_HOST1_SSRXP: CN5.45 U4.U28(USB3_HOST1_SSRXP/SATA1_RXP/QSGMII_RXP_M0)
USB3_HOST1_SSTXN: CN5.41 U4.V27(USB3_HOST1_SSTXN/SATA1_TXN/QSGMII_TXN_M0)
USB3_HOST1_SSTXP: CN5.39 U4.V28(USB3_HOST1_SSTXP/SATA1_TXP/QSGMII_TXP_M0)
USB3_OTG0_DM: U4.P28(USB3_OTG0_DM) ; also on sheet 18
USB3_OTG0_DP: U4.P27(USB3_OTG0_DP) ; also on sheet 18
USB3_OTG0_ID: CN5.63 U4.L23(USB3_OTG0_ID)
USB3_OTG0_SSRXN: CN5.59 U4.R27(USB3_OTG0_SSRXN/SATA0_RXN)
USB3_OTG0_SSRXP: CN5.57 U4.R28(USB3_OTG0_SSRXP/SATA0_RXP)
USB3_OTG0_SSTXN: CN5.53 U4.T27(USB3_OTG0_SSTXN/SATA0_TXN)
USB3_OTG0_SSTXP: CN5.51 U4.T28(USB3_OTG0_SSTXP/SATA0_TXP)
USB3_OTG0_VBUSDET: C37.2 U4.M24(USB3_OTG0_VBUSDET) ; also on sheet 18
USB5V0_EN_H_GPIO0_D6: U4.AC24(GPIO0_D6_D)
USB_AVDD_0V9: C40.2 C43.2 U4.P22(USB3_AVDD_0V9) U4.R8(USB2_AVDD_0V9) ; also on sheet 14
USB_AVDD_1V8: C39.2 C42.2 U4.P9(USB2_AVDD_1V8) U4.P23(USB3_AVDD_1V8) ; also on sheet 14
USB_HOST_PWREN_H_GPIO0_A6: U4.AE24(GPIO0_A6_D)
USBCC_INT_L_GPIO0_C5: U4.AC21(GPIO0_C5_D)
WIFI_PWREN_GPIO0_A0: U4.AG27(GPIO0_A0_D)
WIFI_REG_ON_H_GPIO0_C0: U4.AD22(GPIO0_C0_D)
WIFI_WAKE_HOST_H_GPIO0_C4: U4.AD21(GPIO0_C4_D)
$2N934: C188.2 U3.C2(VDDI)
$3N1393: R32.1 U4.AA18(HDMI_TX_REXT)
$12N2488: R13.1 U4.C27(GPIO2_A6_U)
$12N2518: R14.1 U4.C28(GPIO2_A7_U)
$12N2548: R15.1 U4.D27(GPIO2_B0_D)
$12N2578: R16.1 U4.F28(GPIO2_B3_U)
$12N2608: R17.1 U4.G27(GPIO2_B4_U)
$12N2662: R21.1 U4.H24(GPIO2_C3_D)
$12N2692: R20.1 U4.G23(GPIO2_C1_D)
$12N2722: R18.1 U4.G28(GPIO2_B5_U)
$14N1137: R8.1 U4.H7(DDR_RZQ)
$16N3266: R1.2 R3.2 U4.AF27(XOUT24M)
$16N3267: C22.2 R3.1 U1.1(OSC1) U4.AF28(XIN24M)
$16N3270: C20.1 R1.1 U1.3(OSC2)
$17N2367: R12.1 U4.U19(PCIE30_RESREF)
$20N3946: C137.2 R66.1 U2.A2(EN)
$20N3953: L13.1 U2.D3(SW_1) U2.D4(SW_2) U2.E3(SW_3) U2.E4(SW_4)
$20N6747: C204.1 R77.1 U7.1(EN)
$20N6749: L17.1 U7.3(LX)

Not connected (* = marked no-connect by the designer): CN4 43 51 56 58 60 62 64 76 123 124; CN5 62 64 74 76 86 90 92 94 96 98 100 102 104 105 106 107 108 109 110 111 112 113 114 115 116 117 118 119 120 121 122 123 124; U3 G3(RFU); U4 AC14(MIPI_DSI_TX1_D2N)* AC17(MIPI_DSI_TX1_D1N)* AD12(MIPI_DSI_TX1_D3P)* AD14(MIPI_DSI_TX1_D2P)* AD15(MIPI_DSI_TX1_CLKP)* AD17(MIPI_DSI_TX1_D1P)* AD18(MIPI_DSI_TX1_D0P)* AE12(MIPI_DSI_TX1_D3N)* AE15(MIPI_DSI_TX1_CLKN)* AE18(MIPI_DSI_TX1_D0N)* C26(SARADC_VIN1)* D24(SARADC_VIN2)* D26(GPIO2_B1_D)* E23(SARADC_VIN3)* E25(GPIO2_B2_U)* F5(AC1)* F7(AC21)* F8(AC20)* F21(SARADC_VIN7)* F22(SARADC_VIN5)* G20(SARADC_VIN6)* G21(SARADC_VIN4)* J28(EDP_TX_D0P)* K27(EDP_TX_D0N)* K28(EDP_TX_D1P)* L25(EDP_TX_AUXP)* L27(EDP_TX_D1N)* L28(EDP_TX_D2P)* M4(DDR_ECC_DQ1)* M5(DDR_ECC_DQ2)* M7(DDR_ECC_DQ4)* M25(EDP_TX_AUXN)* M27(EDP_TX_D2N)* M28(EDP_TX_D3P)* N27(EDP_TX_D3N)* P1(DDR_ECC_DQS_N)* P2(DDR_ECC_DQS_P)* P4(DDR_ECC_DQ6)* P5(DDR_ECC_DQ0)* P7(DDR_ECC_DM)* P8(DDR_VREFOUT)* R4(DDR_ECC_DQ7)* R5(DDR_ECC_DQ3)* R7(DDR_ECC_DQ5)* R24(MULTI_PHY0_REFCLKP)* R25(MULTI_PHY0_REFCLKN)* U24(MULTI_PHY1_REFCLKN)* U25(MULTI_PHY1_REFCLKP)*

## Notes on the sheets
sheet 4
- Diff 100 Ohm ±10%
- Diff 100 Ohm ±10%
- Diff 100 Ohm ±10%
- Diff 100 Ohm ±10%
- Diff 100 Ohm ±10%
- Diff 100 Ohm ±10%
sheet 6
- DNP
sheet 9
- Diff 90 Ohm ±10%
- Diff 90 Ohm ±10%
- Diff 90 Ohm ±10%
- Diff 90 Ohm ±10%
- Diff 90 Ohm ±10%
- Diff 90 Ohm ±10%
- Diff 90 Ohm ±10%
- Diff 85 Ohm ±10%
- Diff 90 Ohm ±10%
- Diff 85 Ohm ±10%
- Diff 100 Ohm ±10%
- Diff 85 Ohm ±10%
- Diff 85 Ohm ±10%
- Diff 100 Ohm ±10%
- Diff 100 Ohm ±10%
- Diff 100 Ohm ±10%
sheet 12
- DNP
- VCC_LPDDR4_VCC
- NC
- ETA3409A/TCS4201:1.0uH/2A
  SY8089AAAC:2.2uH/2A
- Default: LPDDR4=1.1V
